# EAGLE board orb (EAGLE 9.6.2), part 1 of 2
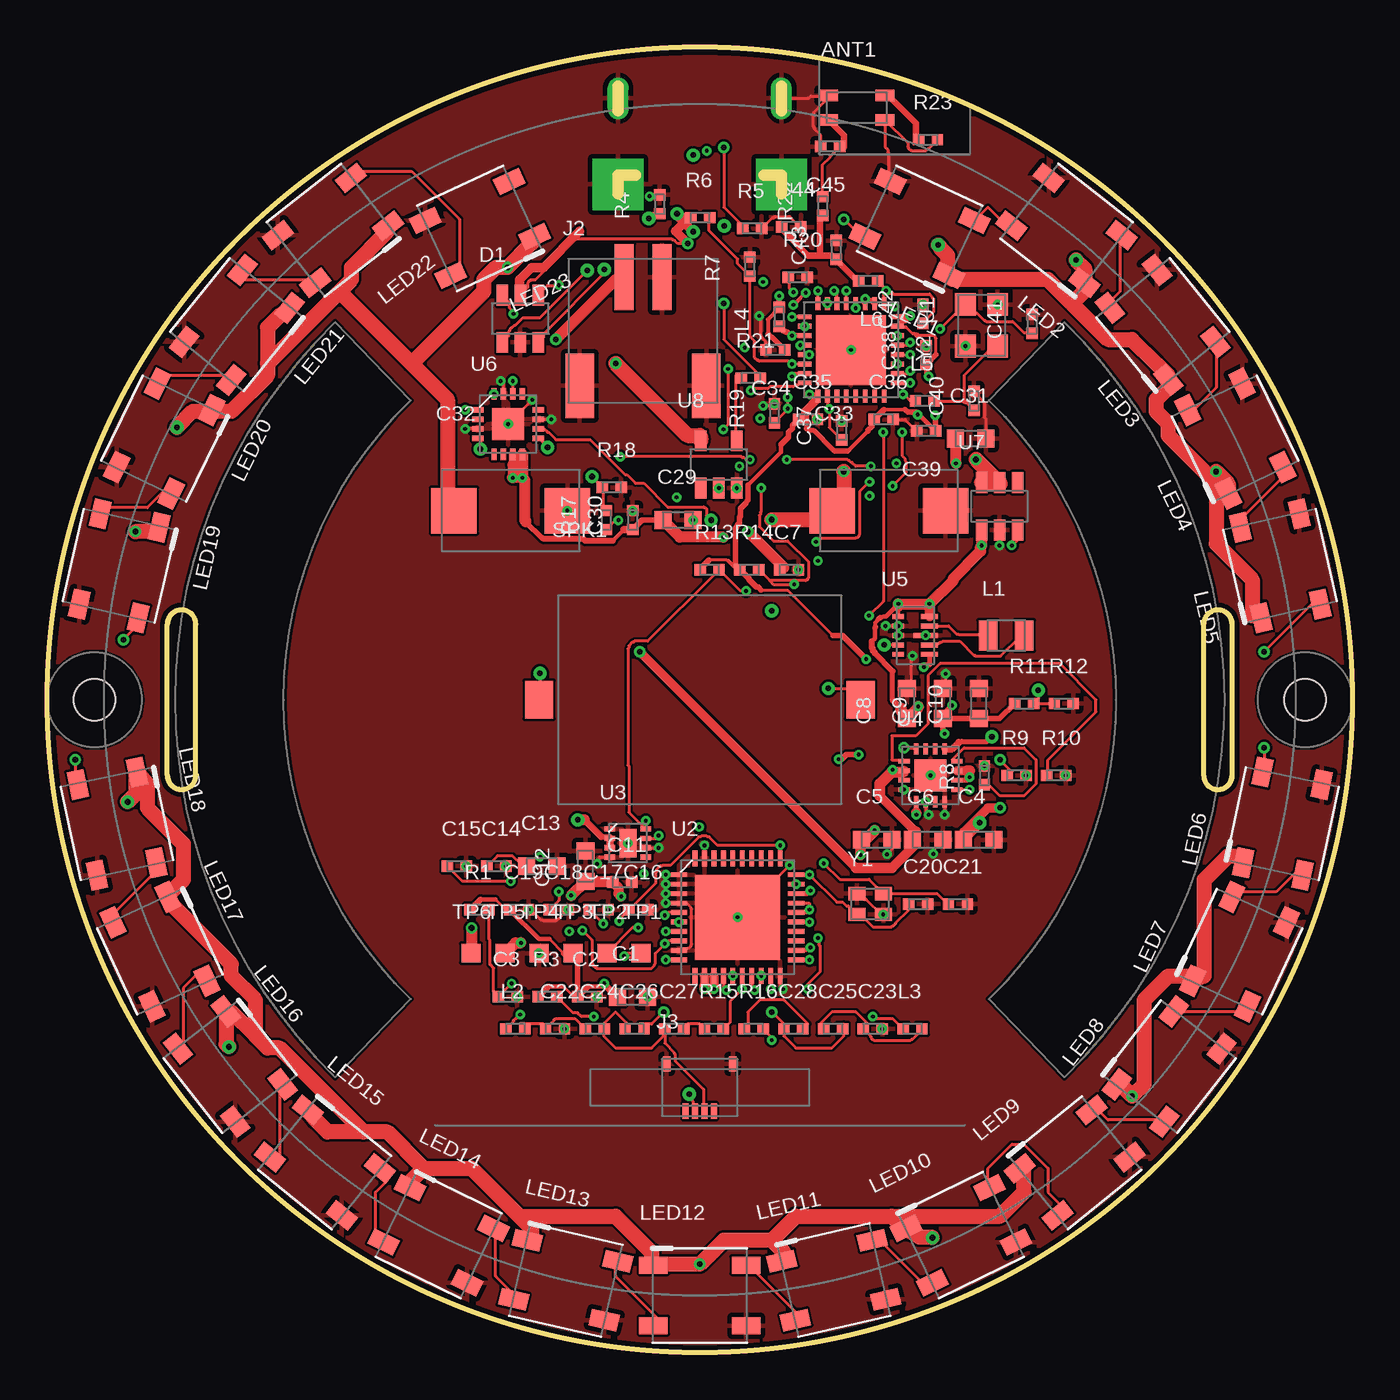
[diagram p6: board, top side]
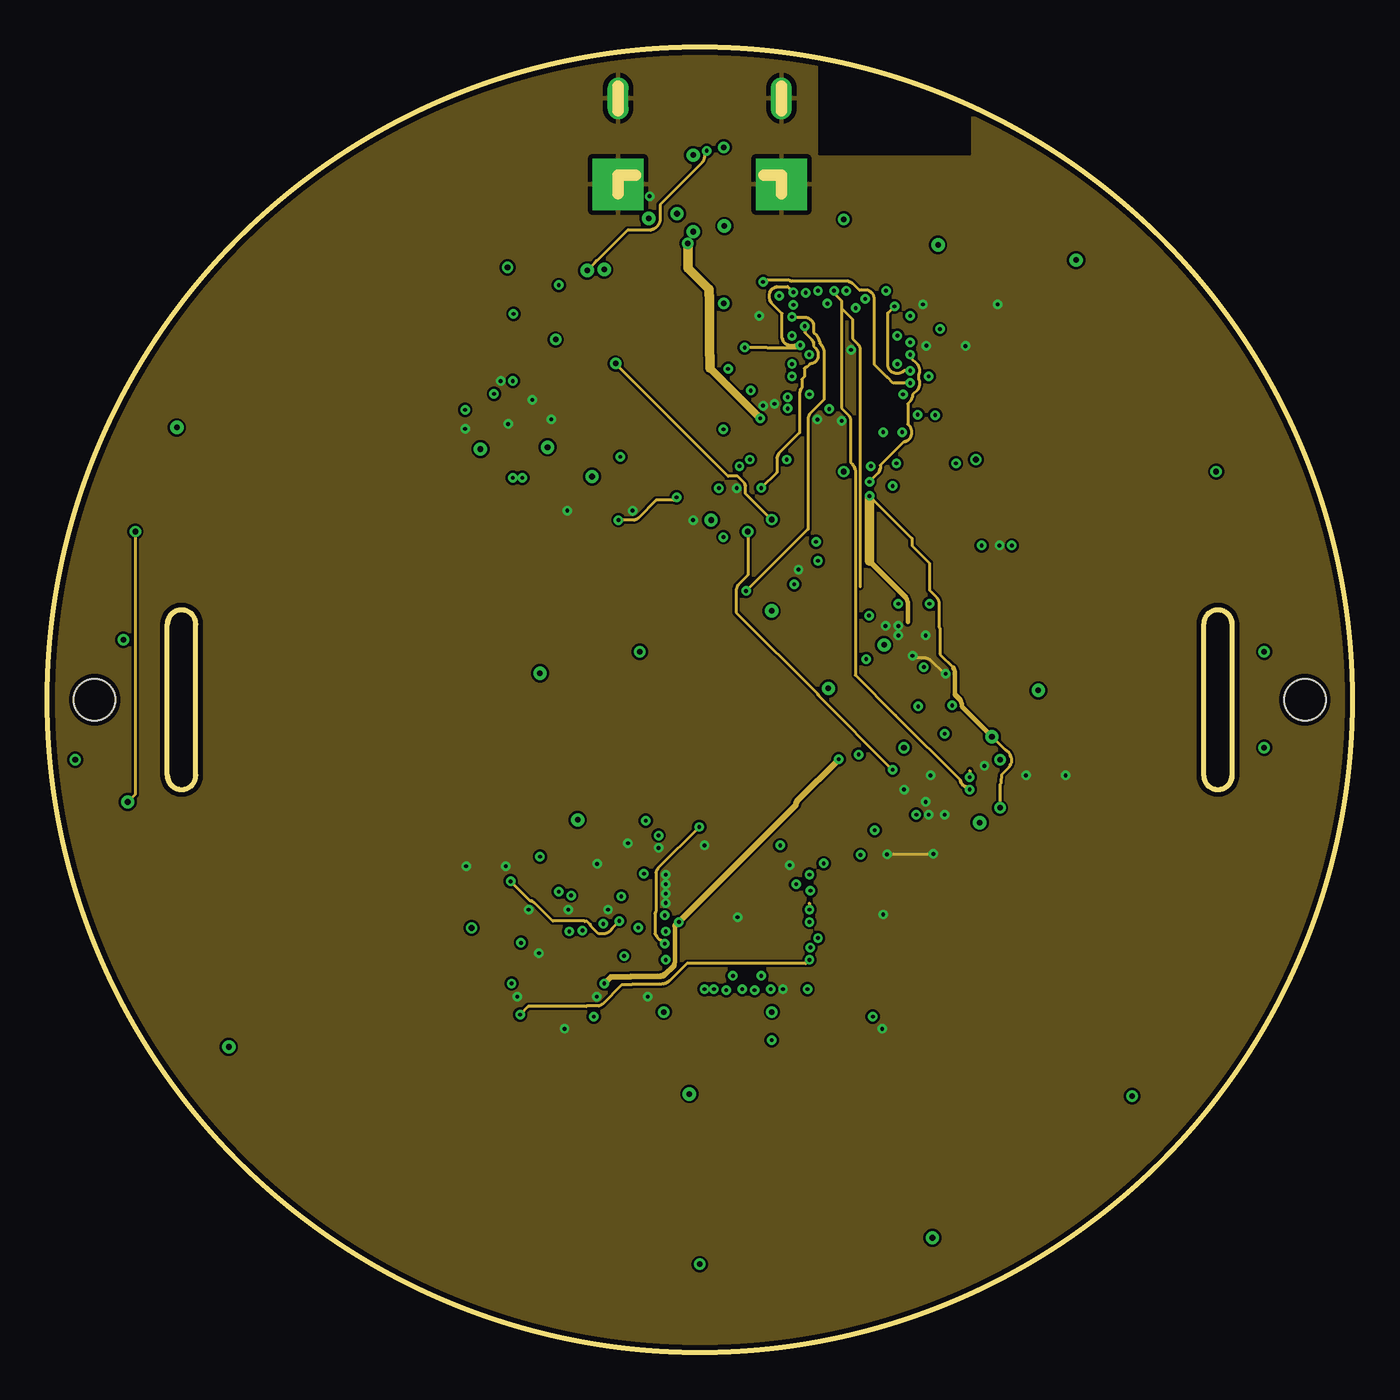
[diagram p7: board, inner layer Route2]
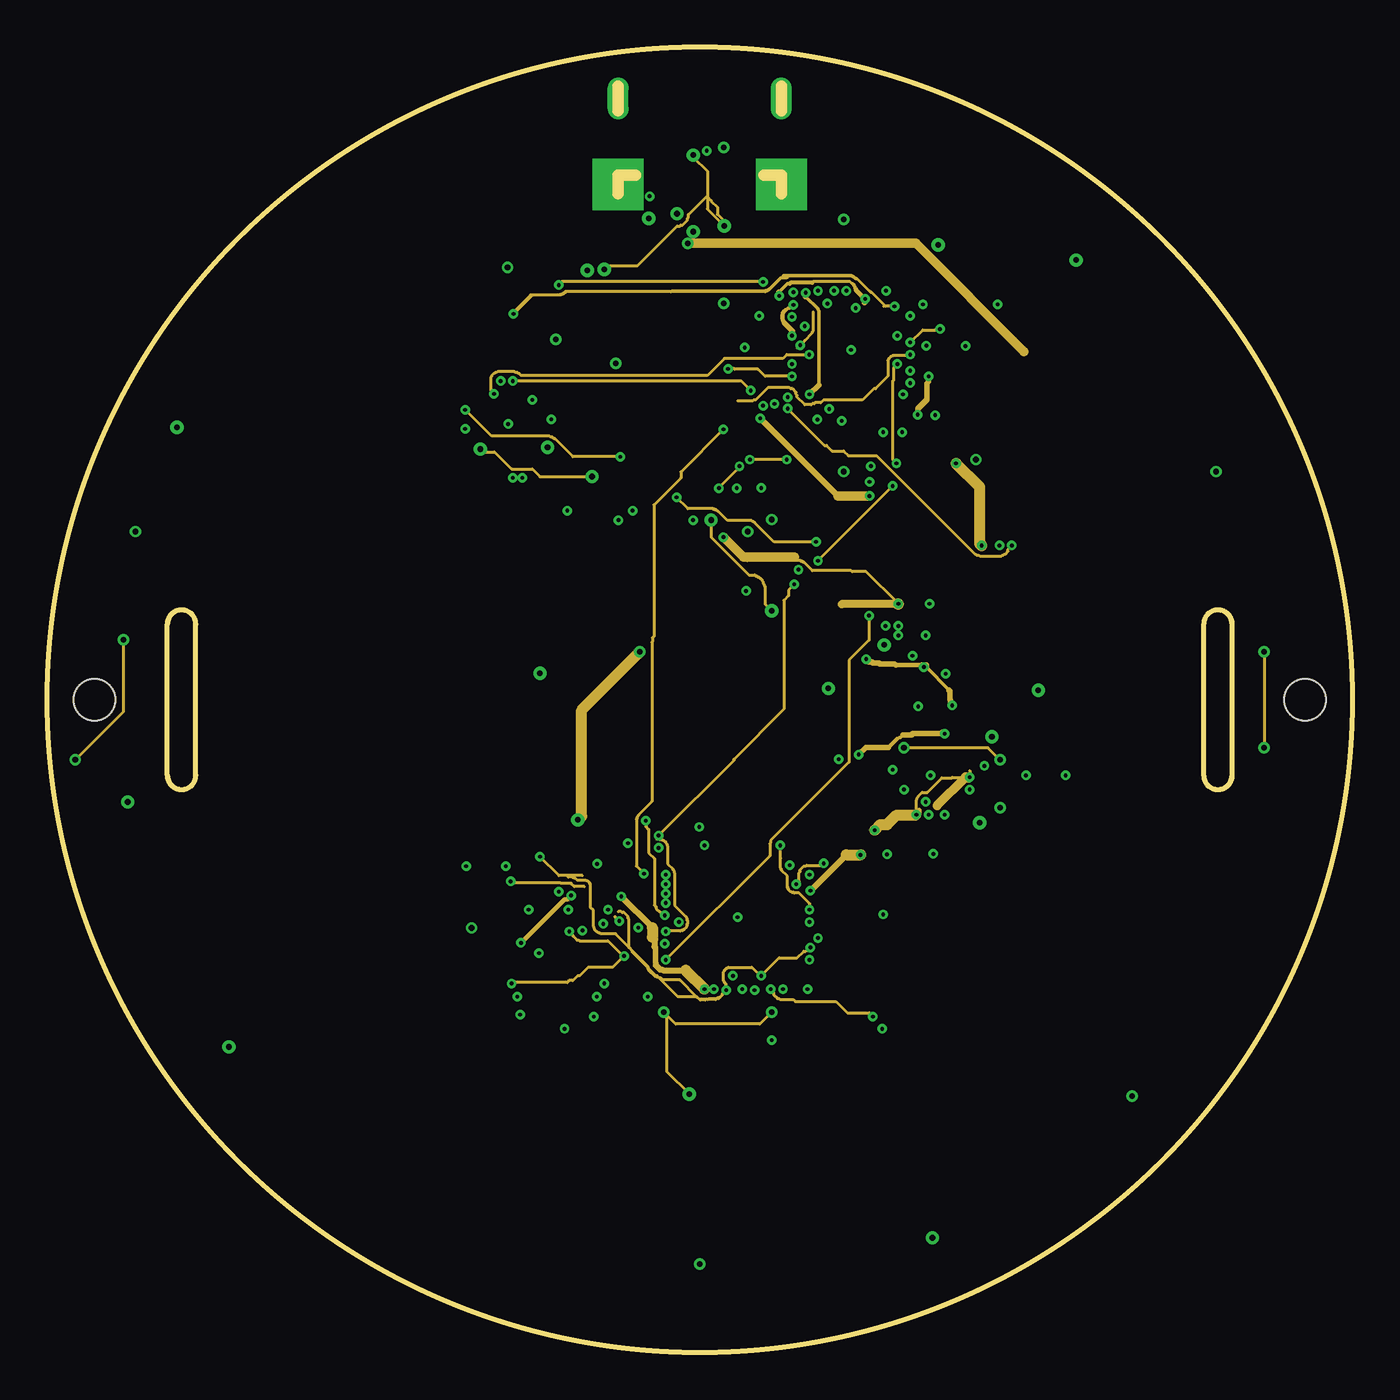
[diagram p8: board, inner layer Route15]
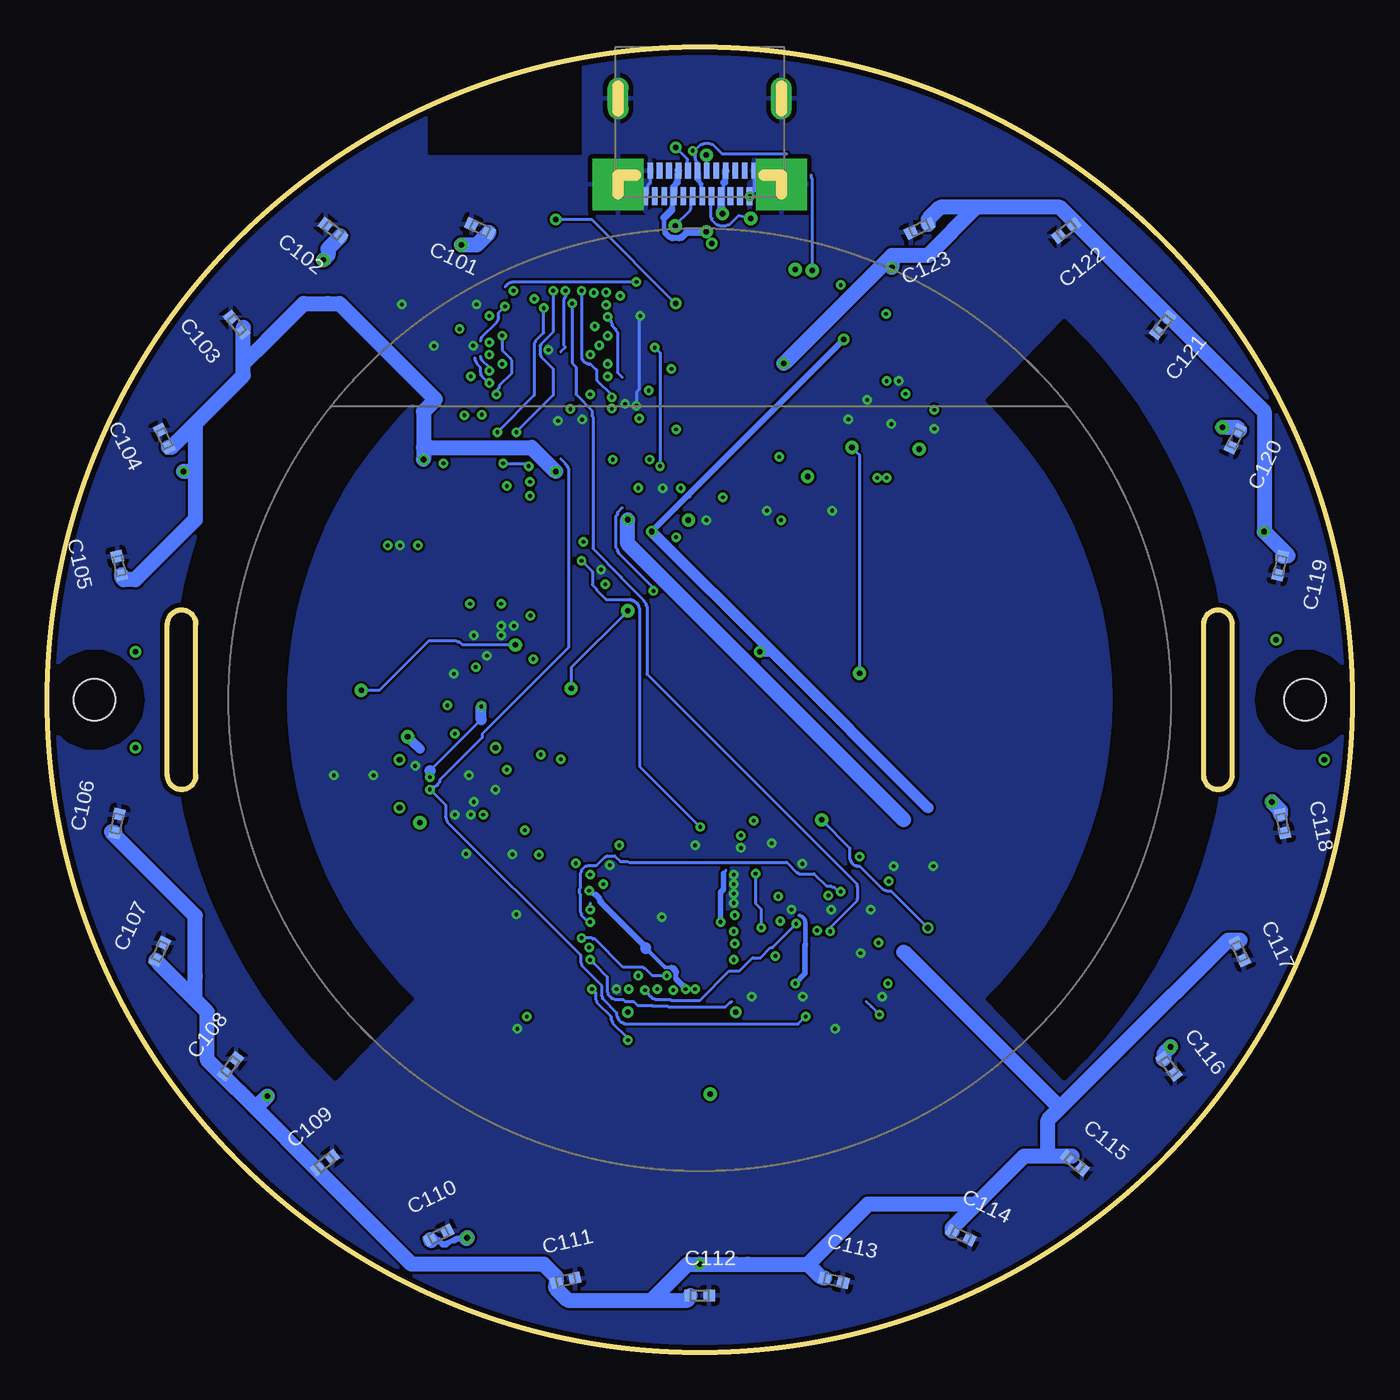
[diagram p9: board, bottom side, seen from below]

Size 69 x 69 mm. Coordinates in mm from the lower left corner, seen from the top.
Outline: 7.85,30.5 7.85,38.5 arc180 6.35,38.5 6.35,30.5 arc180 7.85,30.5
Outline: 62.65,30.5 62.65,38.5 arc180 61.15,38.5 61.15,30.5 arc180 62.65,30.5
Outline: circle at 34.5,34.5 radius 34.5
Copper layers (1+2*15+16): Top / Route2 / Route15 / Bottom
Stack-up Default Layer Stack: Top User Defined 0.035mm / Dielectric-2 User Defined 0.2104mm / Route2 User Defined 0.0152mm / Dielectric-1 User Defined 1.065mm / Route15 User Defined 0.0152mm / Dielectric-3 User Defined 0.2mm / Bottom User Defined 0.035mm
Design rules: minimum drill size class=1 0.2mm, minimum drill size class=2 0.2mm, minimum drill size class=5 0.2mm, minimum drill size class=3 0.2mm, minimum drill size class=4 0.2mm, minimum drill size class=0 0.2mm, minimum drill size 0.2mm, minimum copper width class=2 0.15mm, minimum copper width class=1 0.15mm, minimum copper width class=4 0.15mm, minimum copper width class=3 0.15mm, minimum copper width class=5 0.15mm, minimum copper width class=0 0.15mm, minimum copper width 0.15mm, keepout clearance 0mil, drill distance 0.2mm, via restrict clearance 0mil, dimension clearance 0.25mm, restrict clearance 0mil, copper clearance wire_polygon to wire_polygon 5mil, copper clearance wire_polygon to pad_smd 5mil, copper clearance wire_polygon to via 5mil, copper clearance pad_smd to pad_smd 5mil, copper clearance pad_smd to via 5mil, copper clearance via to via 5mil, copper clearance smd to pad (same net) 5mil, copper clearance smd to via (same net) 0mm, copper clearance smd to smd (same net) 5mil
Net classes: 0 signal: width 0.15 mm, drill 0.2 mm; 1 power: width 0.15 mm, drill 0.2 mm; 2 LED-power: width 0.15 mm, drill 0.2 mm; 3 3V3: width 0.15 mm, drill 0.2 mm; 4 RF: width 0.15 mm, drill 0.2 mm; 5 USB: width 0.15 mm, drill 0.2 mm
Holes 2.2 mm at 2.5,34.5 66.5,34.5
tRestrict: area 0,32 to 5,37; area 64,32 to 69,37; area 49.8,14.5 to 62.2,54.5; area 6.8,14.5 to 19.2,54.5
bRestrict: area 0,32 to 5,37; area 64,32 to 69,37; area 49.8,14.5 to 62.2,54.5; area 6.8,14.5 to 19.2,54.5
vRestrict: area 49.8,14.5 to 62.2,54.5; area 6.8,14.5 to 19.2,54.5

## Footprints (pad centres in the part's own frame; a part is rotated, then mirrored left to right if it is on the bottom)
JOHANSON_2450AT18D = smd 1 x 0.6: 1 -1.5,-0.65; 2 1.5,-0.65; 3 1.5,0.65; 4 -1.5,0.65
C0603 = smd 0.9 x 0.95: 1 -0.8,0; 2 0.8,0
C0402 = smd 0.6 x 0.6: 1 -0.5,0; 2 0.5,0
CPOL7343 = smd 2.4 x 2.4: 1 -3,0; 2 3,0
SOT23_6 = smd 0.6 x 1.1: 1 -0.95,-1.25; 2 0,-1.25; 3 0.95,-1.25; 4 0.95,1.25; 5 0,1.25; 6 -0.95,1.25
USBC24_TE2345986 = smd 0.3 x 0.95: A1 2.625,-7.875; A2 2.125,-7.875; A3 1.625,-7.875; A4 1.125,-7.875; A5 0.625,-7.875; A6 0.125,-7.875; A7 -0.375,-7.875; A8 -0.875,-7.875; A9 -1.375,-7.875; A10 -1.875,-7.875; A11 -2.375,-7.875; A12 -2.875,-7.875 | smd 0.3 x 0.85: B1 -2.625,-6.525; B2 -2.125,-6.525; B3 -1.625,-6.525; B4 -1.125,-6.525; B5 -0.625,-6.525; B6 -0.125,-6.525; B7 0.375,-6.525; B8 0.875,-6.525; B9 1.375,-6.525; B10 1.875,-6.525; B11 2.375,-6.525; B12 2.875,-6.525 | drill 0.6 pad 2.7 square: S1 -4.32,-7.25; S2 4.32,-7.25 | drill 0.6 pad 1.075 long: S3 -4.32,-2.7; S4 4.32,-2.7
JST_S2B_PH_SM4_TB = smd 1 x 3.5: 1 -1,2.85; 2 1,2.85 | smd 1.5 x 3.4: S1 -3.35,-2.9; S2 3.35,-2.9
FPC4_PLACEHOLDER = smd 0.3 x 0.8: 1 0.75,-1.25; 2 0.25,-1.25; 3 -0.25,-1.25; 4 -0.75,-1.25 | smd 0.4 x 0.8: M1 -1.75,1.25; M2 1.75,1.25
L2016 = smd 1 x 1.6: 1 -0.95,0; 2 0.95,0
L0402 = smd 0.6 x 0.6: 1 -0.5,0; 2 0.5,0
WS2812B_5050 = smd 1.5 x 0.9: 1 -2.45,1.6; 2 -2.45,-1.6; 3 2.45,-1.6; 4 2.45,1.6
R0402 = smd 0.6 x 0.6: 1 -0.5,0; 2 0.5,0
SPK_PADS = smd 1.5 x 2: 1 -8.5,0; 2 8.5,0
TP1MM = smd 1 x 1: 1 0,0
ESP32C3_QFN32 = smd 0.7 x 0.25: 1 -2.45,1.75; 2 -2.45,1.25; 3 -2.45,0.75; 4 -2.45,0.25; 5 -2.45,-0.25; 6 -2.45,-0.75; 7 -2.45,-1.25; 8 -2.45,-1.75; 17 2.45,-1.75; 18 2.45,-1.25; 19 2.45,-0.75; 20 2.45,-0.25; 21 2.45,0.25; 22 2.45,0.75; 23 2.45,1.25; 24 2.45,1.75 | smd 0.25 x 0.7: 9 -1.75,-2.45; 10 -1.25,-2.45; 11 -0.75,-2.45; 12 -0.25,-2.45; 13 0.25,-2.45; 14 0.75,-2.45; 15 1.25,-2.45; 16 1.75,-2.45; 25 1.75,2.45; 26 1.25,2.45; 27 0.75,2.45; 28 0.25,2.45; 29 -0.25,2.45; 30 -0.75,2.45; 31 -1.25,2.45; 32 -1.75,2.45 | smd 3.7 x 3.7: 33 0,0
HVQFN40_6X6 = smd 0.85 x 0.25: 1 -3.1,2.25; 2 -3.1,1.75; 3 -3.1,1.25; 4 -3.1,0.75; 5 -3.1,0.25; 6 -3.1,-0.25; 7 -3.1,-0.75; 8 -3.1,-1.25; 9 -3.1,-1.75; 10 -3.1,-2.25; 21 3.1,-2.25; 22 3.1,-1.75; 23 3.1,-1.25; 24 3.1,-0.75; 25 3.1,-0.25; 26 3.1,0.25; 27 3.1,0.75; 28 3.1,1.25; 29 3.1,1.75; 30 3.1,2.25 | smd 0.25 x 0.85: 11 -2.25,-3.1; 12 -1.75,-3.1; 13 -1.25,-3.1; 14 -0.75,-3.1; 15 -0.25,-3.1; 16 0.25,-3.1; 17 0.75,-3.1; 18 1.25,-3.1; 19 1.75,-3.1; 20 2.25,-3.1; 31 2.25,3.1; 32 1.75,3.1; 33 1.25,3.1; 34 0.75,3.1; 35 0.25,3.1; 36 -0.25,3.1; 37 -0.75,3.1; 38 -1.25,3.1; 39 -1.75,3.1; 40 -2.25,3.1 | smd 4.5 x 4.5: 41 0,0
TDFN8_2X2 = smd 0.55 x 0.28: 1 -0.95,0.75; 2 -0.95,0.25; 3 -0.95,-0.25; 4 -0.95,-0.75; 5 0.95,-0.75; 6 0.95,-0.25; 7 0.95,0.25; 8 0.95,0.75 | smd 0.9 x 1.5: 9 0,0
VQFN16_3X3 = smd 0.6 x 0.24: 1 -1.4,0.75; 2 -1.4,0.25; 3 -1.4,-0.25; 4 -1.4,-0.75; 9 1.4,-0.75; 10 1.4,-0.25; 11 1.4,0.25; 12 1.4,0.75 | smd 0.24 x 0.6: 5 -0.75,-1.4; 6 -0.25,-1.4; 7 0.25,-1.4; 8 0.75,-1.4; 13 0.75,1.4; 14 0.25,1.4; 15 -0.25,1.4; 16 -0.75,1.4 | smd 1.68 x 1.68: 17 0,0
VSON10_2X3 = smd 0.6 x 0.25: 1 -0.9,1; 2 -0.9,0.5; 3 -0.9,0; 4 -0.9,-0.5; 5 -0.9,-1 | smd 0.9 x 0.25: 6 0.75,-1; 7 0.75,-0.5; 9 0.75,0.5; 10 0.75,1 | smd 1.3 x 0.25: 8 0.55,0
TQFN16_3X3 = smd 0.6 x 0.28: 1 -1.6,0.75; 2 -1.6,0.25; 3 -1.6,-0.25; 4 -1.6,-0.75; 9 1.6,-0.75; 10 1.6,-0.25; 11 1.6,0.25; 12 1.6,0.75 | smd 0.28 x 0.6: 5 -0.75,-1.6; 6 -0.25,-1.6; 7 0.25,-1.6; 8 0.75,-1.6; 13 0.75,1.6; 14 0.25,1.6; 15 -0.25,1.6; 16 -0.75,1.6 | smd 1.7 x 1.7: 17 0,0
SOT23_5 = smd 0.6 x 1.1: 1 -0.95,-1.25; 2 0,-1.25; 3 0.95,-1.25; 4 0.95,1.25; 5 -0.95,1.25
XTAL2016 = smd 0.9 x 0.7: 1 -0.7,-0.55; 2 0.7,-0.55; 3 0.7,0.55; 4 -0.7,0.55
ABM8_3225 = smd 1.2 x 1.1: 1 -1.1,-0.85; 2 1.1,-0.85; 3 1.1,0.85; 4 -1.1,0.85

## Placement (x,y rotation side)
ANT1  2450AT18D0100001E  [JOHANSON_2450AT18D]  42.8,65.8 0 top
C1  10uF  [C0603]  30.95,18.8 0 top
C2  100nF  [C0402]  28.55,18.8 0 top
C3  1uF  [C0402]  24.35,18.8 0 top
C4  4.7uF  [C0603]  49.25,27.1 0 top
C5  10uF  [C0603]  43.85,27.1 0 top
C6  10uF  [C0603]  46.55,27.1 0 top
C7  100nF  [C0402]  39.22,41.38 0 top
C8  10uF  [C0603]  45.45,34.3 90 top
C9  10uF  [C0603]  47.35,34.3 90 top
C10  10uF  [C0603]  49.25,34.3 90 top
C11  100nF  [C0402]  30.4,24.85 0 top
C12  4.7uF  [C0603]  28.45,25.7 90 top
C13  4.7uF  [C0603]  26.15,25.7 0 top
C14  100nF  [C0402]  23.75,25.7 0 top
C15  1uF  [C0402]  21.65,25.7 0 top
C16  100nF  [C0402]  31.25,23.4 0 top
C17  100nF  [C0402]  29.15,23.4 0 top
C18  100nF  [C0402]  27.05,23.4 0 top
C19  100nF  [C0402]  24.95,23.4 0 top
C20  12pF  [C0402]  46.05,23.7 0 top
C21  12pF  [C0402]  48.15,23.7 0 top
C22  TBD  [C0402]  26.85,17.1 0 top
C23  TBD  [C0402]  43.65,17.1 0 top
C24  TBD  [C0402]  28.95,17.1 0 top
C25  TBD  [C0402]  41.55,17.1 0 top
C26  TBD  [C0402]  31.05,17.1 0 top
C27  TBD  [C0402]  33.15,17.1 0 top
C28  TBD  [C0402]  39.45,17.1 0 top
C29  10uF  [C0603]  33.35,44 0 top
C30  100nF  [C0402]  30.95,44 90 top
C31  10uF  [C0603]  48.82,48.3 0 top
C32  100uF  [CPOL7343]  24.5,44.5 0 top
C33  100uF  [CPOL7343]  44.5,44.5 0 top
C34  1uF  [C0402]  38.5,53 180 top
C35  100nF  [C0402]  40.22,49.32 0 top
C36  100nF  [C0402]  44.22,49.32 0 top
C37  1uF  [C0402]  42,48.75 90 top
C38  1uF  [C0402]  46.48,52.72 90 top
C39  10nF  [C0402]  46.47,48.71 180 top
C40  16pF  [C0402]  49,50.3 90 top
C41  16pF  [C0402]  52.07,54.37 90 top
C42  1pF  [C0402]  46.3,54.9 90 top
C43  1pF  [C0402]  41.72,58.28 90 top
C44  1pF  [C0402]  39.34,59.5 0 top
C45  1pF  [C0402]  41.4,63.75 180 top
C101  100nF  [C0402]  46.12,59.42 155 bottom
C102  100nF  [C0402]  53.89,59.32 142 bottom
C103  100nF  [C0402]  58.98,54.32 129 bottom
C104  100nF  [C0402]  62.81,48.31 116 bottom
C105  100nF  [C0402]  65.19,41.59 103 bottom
C106  100nF  [C0402]  65.31,27.95 78 bottom
C107  100nF  [C0402]  63.05,21.19 65 bottom
C108  100nF  [C0402]  59.32,15.11 52 bottom
C109  100nF  [C0402]  54.32,10.02 39 bottom
C110  100nF  [C0402]  48.31,6.19 26 bottom
C111  100nF  [C0402]  41.59,3.81 13 bottom
C112  100nF  [C0402]  34.5,3 0 bottom
C113  100nF  [C0402]  27.41,3.81 347 bottom
C114  100nF  [C0402]  20.69,6.19 334 bottom
C115  100nF  [C0402]  14.68,10.02 321 bottom
C116  100nF  [C0402]  9.68,15.11 308 bottom
C117  100nF  [C0402]  5.95,21.19 295 bottom
C118  100nF  [C0402]  3.69,27.95 282 bottom
C119  100nF  [C0402]  3.81,41.59 257 bottom
C120  100nF  [C0402]  6.19,48.31 244 bottom
C121  100nF  [C0402]  10.02,54.32 231 bottom
C122  100nF  [C0402]  15.11,59.32 218 bottom
C123  100nF  [C0402]  22.88,59.42 205 bottom
D1  USBLC6-2SC6  [SOT23_6]  25.01,54.65 0 top
J1  USB-C  [USBC24_TE2345986]  34.5,69 0 bottom
J2  BAT  [JST_S2B_PH_SM4_TB]  31.5,54 0 top
J3  NFC antenna  [FPC4_PLACEHOLDER]  34.5,14 0 top
L1  0.47uH  [L2016]  50.7,37.9 0 top
L2  TBD  [L0402]  24.75,17.1 0 top
L3  TBD  [L0402]  45.75,17.1 0 top
L4  2nH  [L0402]  38.7,54.75 90 top
L5  24nH  [L0402]  46.4,50.3 0 top
L6  2.4nH  [L0402]  43.4,56.65 180 top
LED1  WS2812B  [WS2812B_5050]  46.12,59.42 155 top
LED2  WS2812B  [WS2812B_5050]  53.89,59.32 142 top
LED3  WS2812B  [WS2812B_5050]  58.98,54.32 129 top
LED4  WS2812B  [WS2812B_5050]  62.81,48.31 116 top
LED5  WS2812B  [WS2812B_5050]  65.19,41.59 103 top
LED6  WS2812B  [WS2812B_5050]  65.31,27.95 78 top
LED7  WS2812B  [WS2812B_5050]  63.05,21.19 65 top
LED8  WS2812B  [WS2812B_5050]  59.32,15.11 52 top
LED9  WS2812B  [WS2812B_5050]  54.32,10.02 39 top
LED10  WS2812B  [WS2812B_5050]  48.31,6.19 26 top
LED11  WS2812B  [WS2812B_5050]  41.59,3.81 13 top
LED12  WS2812B  [WS2812B_5050]  34.5,3 0 top
LED13  WS2812B  [WS2812B_5050]  27.41,3.81 347 top
LED14  WS2812B  [WS2812B_5050]  20.69,6.19 334 top
LED15  WS2812B  [WS2812B_5050]  14.68,10.02 321 top
LED16  WS2812B  [WS2812B_5050]  9.68,15.11 308 top
LED17  WS2812B  [WS2812B_5050]  5.95,21.19 295 top
LED18  WS2812B  [WS2812B_5050]  3.69,27.95 282 top
LED19  WS2812B  [WS2812B_5050]  3.81,41.59 257 top
LED20  WS2812B  [WS2812B_5050]  6.19,48.31 244 top
LED21  WS2812B  [WS2812B_5050]  10.02,54.32 231 top
LED22  WS2812B  [WS2812B_5050]  15.11,59.32 218 top
LED23  WS2812B  [WS2812B_5050]  22.88,59.42 205 top
R1  10k  [R0402]  22.85,23.4 0 top
R3  100k  [R0402]  26.45,18.8 0 top
R4  5.1k  [R0402]  32.38,60.7 90 top
R5  5.1k  [R0402]  37.27,59.42 0 top
R6  120k  [R0402]  34.52,59.99 0 top
R7  220k  [R0402]  37.15,57.4 90 top
R8  1.8k  [R0402]  49.55,30.5 90 top
R9  1.13k  [R0402]  51.25,30.5 0 top
R10  10k  [R0402]  53.35,30.5 0 top
R11  560k  [R0402]  51.65,34.3 0 top
R12  100k  [R0402]  53.75,34.3 0 top
R13  2.2k  [R0402]  35.02,41.38 0 top
R14  2.2k  [R0402]  37.12,41.38 0 top
R15  TBD  [R0402]  35.25,17.1 0 top
R16  TBD  [R0402]  37.35,17.1 0 top
R17  2k  [R0402]  29.55,44 90 top
R18  100k  [R0402]  29.85,45.73 0 top
R19  100k  [R0402]  38.45,49.65 90 top
R20  100k  [R0402]  39.68,56.84 0 top
R21  33  [R0402]  37.2,51.51 0 top
R22  0  [R0402]  41,60.6 90 top
R23  0  [R0402]  46.57,64.11 0 top
SPK1  CMS-151103-088SP  [SPK_PADS]  34.5,34.5 0 top
TP1  EN  [TP1MM]  31.4,21.1 0 top
TP2  BOOT  [TP1MM]  29.6,21.1 0 top
TP3  3V3  [TP1MM]  27.8,21.1 0 top
TP4  GND  [TP1MM]  26,21.1 0 top
TP5  VSYS  [TP1MM]  24.2,21.1 0 top
TP6  VBAT  [TP1MM]  22.4,21.1 0 top
U1  ESP32-C3FH4X  [ESP32C3_QFN32]  42.5,53 270 top
U2  PN7161A1HN/C101E  [HVQFN40_6X6]  36.5,23 0 top
U3  MAX17048G+T10  [TDFN8_2X2]  30.7,26.92 0 top
U4  BQ24074RGTR  [VQFN16_3X3]  46.7,30.5 0 top
U5  TPS63802DLAR  [VSON10_2X3]  45.9,37.9 0 top
U6  MAX98357AETE+T  [TQFN16_3X3]  24.37,49.08 0 top
U7  TPS22918DBVR  [SOT23_6]  50.35,44.73 0 top
U8  SN74LV1T34DBVR  [SOT23_5]  35.51,46.94 0 top
Y1  27.12MHz  [XTAL2016]  43.5,23.7 0 top
Y2  40MHz  [ABM8_3225]  49.4,54.3 90 top

## Tracks (layer width: path | path; a pad name or v marks a point on that pad's centre or on a via)
3V3  (via drill 0.2 pad 0.45, 0.2 pad 0.5)
  Top 0.15: 24.25,23.4 23.7,23.95 | 29.95,18.8 29.4,19.35 v29.45,19.5 29.48,19.48 | 36,41.85 35.95,41.85 35.9,41.9 | 27.85,18.8 27.35,19.3 27.3,19.3 27.25,19.35 | 47,53.6 46.95,53.65 46.95,53.7 46.9,53.75 46,53.75 | 27.3,21.1 26.55,21.85 | 37.75,40.3 39.15,40.3 41.55,37.9 | 39.5,53.75 v39.38,53.75 | 45.5,54.75 v45.62,54.8 45.6,54.8 | 39.35,53.75 v39.38,53.75 | 45.95,49.7 v46.02,49.58 46.02,49.62 | 40.35,50.6 v40.3,50.65 | 46.5,51.7 v46.6,51.6 | 47.35,32.8 v47.45,32.7 | 42,31.35 v41.85,31.35 | 46.48,36.35 v46.35,36.23 | 39.4,53.85 v39.38,53.75 | 39.48,55.38 v39.45,55.38
  Top 0.16: 45.85,53.85 45.75,53.85 45.4,54.2
  Top 0.166: 35.9,41.9 35,41.9 | 47,52.75 47,53.6
  Top 0.182: 45.4,54.2 45,54.2 U1.31
  Top 0.186: 44.25,49.85 45.35,49.85
  Top 0.187: 39.83,55.73 39.83,55.75 v40.1,56.02
  Top 0.198: 45.95,53.8 45.9,53.8 45.85,53.85
  Top 0.216: 38.8,47.6 37.05,45.85 | 39.48,55.38 39.83,55.73
  Top 0.221: 36.45,41.4 36,41.85 | 42.4,47.7 43.4,48.7
  Top 0.226: 23.7,23.95 22.9,23.95 | 29.4,19.35 28.6,19.35 | 27.25,19.35 26.5,19.35 | 26.55,21.85 26,21.85 C19.1 | 38.8,48 38.8,47.6
  Top 0.236: 42.3,47.65 42.35,47.7 42.4,47.7
  Top 0.237: 40.2,49.8 40.2,49.75 40.15,49.7
  Top 0.249: 45.95,49.7 46.02,49.62 46.95,48.7
  Top 0.251: 46,53.75 45.95,53.8
  Top 0.263: 37.05,45.05 36.95,44.95 36.95,44.9
  Top 0.265: 41.55,47.7 41.6,47.7 41.65,47.65
  Top 0.266: 40.15,49.7 40.15,48.85 | 40.25,48.75 40.5,48.75 41.55,47.7
  Top 0.271: 36.5,43.75 36.5,43.7 36.45,43.65
  Top 0.276: U5.6 46.65,36.35 | 46.65,36.35 v46.35,36.23 | U1.31 45.25,54.55 | 46.65,36.35 46.48,36.35 | U1.11 39.5,53.75 U1.11
  Top 0.278: 46.5,52.25 47,52.75
  Top 0.28: 36.45,43.65 36.45,43.6 36.4,43.55
  Top 0.287: 37.1,40.85 37.5,40.45
  Top 0.29: U1.32 45.5,54.75 v45.62,54.8 45.6,54.8 45.35,54.55 45.25,54.55 | L4.1 38.95,54 39,54 39.05,53.95 39.15,53.95 39.35,53.75 v39.38,53.75 39.5,53.75 39.4,53.85 | U1.17 40,49.8 40,49.6 C35.1 | 39.7,49.3 C35.1 | C9.1 C10.1 50.35,33.5 R11.1 | C19.1 24.25,23.4 | 22.9,23.95 R1.1 | C1.1 29.95,18.8 | 28.6,19.35 C2.1 | R14.1 36.6,41.4 | 36.6,41.4 36.45,41.4 | 35,41.9 34.5,41.4 R13.1 | C2.1 27.85,18.8 | 26.5,19.35 R3.1 | C2.1 28.05,20.85 TP3.1 27.3,21.1 | 46.5,52.2 C38.1 46.5,52.2 | 46.5,52.2 46.5,52.25 | v47.85,34.2 47.6,33.95 47.6,33.9 47.4,33.7 47.4,33.55 C9.1 | U1.17 40.75,50.35 40.2,49.8 | 40.15,48.85 40.25,48.75 | 41.65,47.65 42.3,47.65 | 43.4,48.7 43.4,48.75 43.6,48.95 43.6,49.2 43.7,49.3 | 43.7,49.3 C36.1 | C36.1 43.7,49.3 | 45.35,49.85 45.5,49.7 45.95,49.7 46.02,49.62 v46.02,49.58 | 46.95,48.7 C39.1 46.95,48.7 | v40.3,50.65 40.35,50.6 40.7,50.6 U1.17 | 46.95,48.7 v46.95,49.55 | v46.6,51.6 46.5,51.7 46.5,52.2 | C35.1 39.7,49.3 | 39.7,49.3 39.4,49 39.4,48.85 39.2,48.65 39.2,48.4 38.8,48 | 37.05,45.85 37.05,45.05 | 36.95,44.9 36.65,44.6 36.65,44.2 36.6,44.15 36.6,43.85 36.5,43.75 | 36.4,43.55 36.4,41.6 36.6,41.4 | 36.6,41.4 R14.1 | R14.1 36.6,41.4 | 37.1,40.85 37.1,40.9 R14.1 | 37.5,40.45 37.6,40.45 37.75,40.3 | 41.55,37.9 42.05,37.9 v43.3,36.65 | C9.1 47.35,32.8 | 47.35,32.8 v47.45,32.7 47.35,32.8 | v42.9,31.6 42.25,31.6 42,31.35 v41.85,31.35 | v39.45,55.38 39.48,55.38 | 29.48,19.48 C1.1 | C35.1 39.7,49.3 | 43.7,49.3 C36.1 | C36.1 44.25,49.85 | 36.6,41.4 R14.1 | v29.45,19.5 29.48,19.48 | 29.48,19.48 C1.1
  Route2 0.223: 33.2,20.62 33.17,20.6 33.17,20.55
  Route2 0.226: 33.2,22.55 33.2,20.62
  Route2 0.233: 33.17,20.55 33.15,20.52 33.15,20.48
  Route2 0.257: 33.15,20.48 33.1,20.43 33.1,20.4
  Route2 0.287: 33.1,20.4 32.67,19.98
  Route2 0.29: v41.85,31.35 39.65,29.15 39.65,29.1 39.6,29.05 39.6,28.95 U2.6 33.2,22.55 | 32.67,19.98 32.62,19.98 32.55,19.9 32.45,19.9 32.42,19.88 30.88,19.88 30.85,19.85 29.8,19.85 v29.45,19.5
  Route15 0.15: 40.77,55.12 40.77,55.08 40.8,55.05 | 46.48,36.35 v46.35,36.23 | 46.48,36.23 v46.35,36.23 | 47.75,34.3 v47.85,34.2 | 43.45,36.5 v43.3,36.65 | 46.25,36.33 v46.35,36.23 | 39.4,53.85 v39.38,53.75 | 39.27,55.23 v39.45,55.38 39.3,55.23 | 40.1,55.83 v40.1,56.02 | 47.35,32.8 v47.45,32.7 | 47.3,32.75 v47.45,32.7 | 47.27,32.75 v47.45,32.7 | 47.25,32.73 v47.45,32.7
  Route15 0.159: 40.75,55.17 40.75,55.15 40.77,55.12
  Route15 0.16: 39.17,55.2 39.25,55.2 39.27,55.23
  Route15 0.17: 45.05,32.5 45,32.45 44.95,32.45
  Route15 0.175: 45.25,32.65 45.1,32.5 45.05,32.5
  Route15 0.176: 40.8,55.05 40.8,51.15
  Route15 0.177: 40.1,55.83 40.75,55.17
  Route15 0.181: 46.48,36.23 47.67,35.02
  Route15 0.187: 39.05,55.12 39.08,55.12 39.12,55.17
  Route15 0.188: 39.12,55.17 39.15,55.17 39.17,55.2 | 39.27,55.23 39.3,55.23 v39.45,55.38
  Route15 0.198: 38.88,54.83 38.9,54.85 38.9,54.95
  Route15 0.207: 44.95,32.45 44.48,31.98
  Route15 0.208: 38.9,54.55 38.9,54.62 38.88,54.65
  Route15 0.212: 38.9,54.95 38.95,55 38.95,55.02
  Route15 0.216: 38.95,55.02 39.05,55.12
  Route15 0.226: 44.88,36.33 46.25,36.33 | 38.98,54.42 38.98,54.45 38.92,54.5 | 38.88,54.65 38.88,54.83
  Route15 0.233: 38.92,54.5 38.92,54.52 38.9,54.55
  Route15 0.251: 39.4,54 38.98,54.42
  Route15 0.29: v46.6,51.6 46.6,51.33 46.5,51.23 46.5,50.38 46.02,49.9 46.02,49.62 v46.02,49.58 | 46.48,36.35 46.48,36.23 | 47.67,35.02 47.67,35 47.73,34.95 47.73,34.52 47.75,34.5 47.75,34.3 v47.85,34.2 | v43.3,36.65 43.45,36.5 43.6,36.5 43.65,36.45 43.98,36.45 44.02,36.4 44.8,36.4 44.88,36.33 | 46.25,36.33 v46.35,36.23 | 39.4,53.85 39.4,54 | v40.1,56.02 40.1,55.83 | 40.8,51.15 v40.3,50.65 | 47.35,32.8 47.3,32.75 47.27,32.75 47.25,32.73 45.77,32.73 45.7,32.65 45.25,32.65 | 44.48,31.98 43.27,31.98 v42.9,31.6
  Bottom 0.15: 29.48,19.48 v29.45,19.5
  Bottom 0.16: 29.27,23.1 29.2,23.1
  Bottom 0.166: 33.25,25.32 33.12,25.45 33.12,25.5
  Bottom 0.187: 29.15,23.07 29.1,23.02 29.07,23.02
  Bottom 0.188: 29.2,23.1 29.18,23.07 29.15,23.07
  Bottom 0.198: 29,22.95 29,22.93 28.95,22.88 | 28.93,22.82 28.93,22.75 28.9,22.73
  Bottom 0.211: 28.95,22.88 28.95,22.85 28.93,22.82
  Bottom 0.216: 29.07,23.02 29,22.95
  Bottom 0.226: 28.9,22.73 28.9,21.57
  Bottom 0.29: U2.6 33.4,24.32 33.25,24.48 33.25,25.32 | 28.9,21.57 28.93,21.55 28.93,20.02 v29.45,19.5 29.48,19.48
  other vias: 33.4,22.75
AMP_SD  (via drill 0.2 pad 0.5)
  Top 0.15: U1.28 45.5,52.75 | 30.05,44 v30.2,44 30.05,44 | 30.05,44 R17.1 | v43.48,46.02 42.95,45.5 42.95,43.25 42.92,43.23 42.92,43.17 42.9,43.15 42.9,43.12 42.88,43.1 42.85,43.1 42.8,43.05 42.75,43.05 42.73,43.02 40.83,43.02 v40.65,42.85 | 45.5,52.75 45.6,52.75 | 45.6,52.75 v45.62,52.75 | 45.5,52.75 45.6,52.75 | 45.6,52.75 v45.62,52.75 | 45.5,52.75 v45.62,52.75
  Route2 0.15: v45.62,52.75 45.62,52.62 46.02,52.23 46.02,52.2 46.08,52.15 46.08,52.1 46.1,52.08 46.1,52.02 46.12,52 46.12,51.77 46.1,51.77 46.1,51.7 46.08,51.7 46.08,51.45 46.1,51.42 46.1,51.38 46.12,51.35 46.12,51.12 46.1,51.1 46.1,51.05 46.08,51.02 46.08,50.98 46.02,50.92 46.02,50.9 45.75,50.62 45.75,50.52 45.73,50.5 45.73,50.45 45.7,50.42 45.7,50.38 45.65,50.33 45.65,50.3 45.5,50.15 45.5,49.08 45.6,48.98 45.6,48.95 45.65,48.9 45.65,48.85 45.67,48.83 45.67,48.77 45.7,48.75 45.7,48.52 45.67,48.5 45.67,48.45 45.65,48.42 45.65,48.38 45.6,48.33 45.6,48.3 45.52,48.23 45.5,48.23 45.45,48.17 45.4,48.17 45.38,48.15 45.33,48.15 45.3,48.12 45.27,48.12 44.05,46.9 44.05,46.73 44.02,46.7 44.02,46.65 44,46.62 44,46.58 43.95,46.52 43.95,46.5 v43.48,46.02 | v33.27,45.2 33.12,45.05 32.2,45.05 31.25,44.1 31.23,44.1 31.18,44.05 31.15,44.05 31.12,44.02 31.07,44.02 31.05,44 v30.2,44
  Route15 0.15: v45.62,52.75 45.6,52.75 | 36.5,50.3 37.3,50.3 37.35,50.35 37.45,50.35 38.1,51 39.25,51 39.3,50.95 39.4,50.95 39.6,50.75 39.6,50.65 39.65,50.6 39.65,50.5 40.05,50.1 40.4,50.1 40.45,50.15 40.55,50.15 40.6,50.2 40.9,50.2 41.05,50.35 43.1,50.35 43.7,50.95 43.8,50.95 44.45,51.6 44.45,52.45 44.5,52.5 44.5,52.55 44.6,52.65 44.65,52.65 44.7,52.7 45.55,52.7 | 45.6,52.75 45.55,52.7 | 45.6,52.75 v45.62,52.75 | 45.55,52.7 v45.62,52.75 | v40.65,42.85 38.42,42.85 37.4,43.88 37.38,43.88 37.33,43.92 37.27,43.92 37.23,43.98 35.98,43.98 35.48,44.48 35.45,44.48 35.4,44.52 35.38,44.52 35.35,44.55 35.3,44.55 35.27,44.58 35.23,44.58 35.2,44.6 33.88,44.6 v33.27,45.2
AMP_SD_R  (via drill 0.3 pad 0.7)
  Top 0.15: R17.2 29.42,44.66 29.42,45.93 R18.1 29.35,45.75 v28.8,46.3 | U6.4 22.75,48.35 U6.4 | v22.9,47.75 22.9,48.2 U6.4
  Route15 0.15: 23.05,47.6 v22.9,47.75 23.05,47.6 | 23.05,47.6 23.65,47.6 24.55,46.7 25.65,46.7 26.05,46.3 v28.8,46.3
ANT_FEED
  Top 0.15: R22.2 41,62.8 41.4,63.2 41.4,63.25 C45.1
  Top 0.35: C45.1 42.12,63.71 42.12,64.34 41.48,64.98 ANT1.1
ANT_GND_TUNE
  Top 0.35: R23.1 45.93,64.34 45.93,64.98 44.66,66.25 ANT1.3
BOOT  (via drill 0.2 pad 0.5)
  Top 0.15: U1.15 39.5,51.75 | 39.5,51.75 v39.38,51.6 39.5,51.75 | v36,52 36,49.05 v35.75,48.8 | v31.25,22.45 30.95,22.45 TP2.1
  Route15 0.15: v39.38,51.6 37.95,51.6 37.58,51.98 36.35,51.98 36.33,52 v36,52 | v35.75,48.8 33.5,46.55 33.5,46.23 32.08,44.8 32.08,37.85 32,37.77 32,37.58 31.98,37.55 31.98,29.12 31.25,28.4 31.25,28.38 31.2,28.32 31.2,28.3 31.18,28.27 31.18,28.2 31.15,28.18 31.15,25.7 v31.55,25.3
  Bottom 0.15: v31.55,25.3 31.55,23.73 31.27,23.45 31.27,22.48 | 31.27,22.48 v31.25,22.45 31.27,22.48
CC1  (via drill 0.3 pad 0.7)
  Top 0.15: R4.1 32.4,60.2 R4.1 | 31.75,60.2 v31.8,59.95 31.75,60.2 | R4.1 31.75,60.2
  Bottom 0.15: v31.8,59.95 32.45,60.1 32.95,59.6 33.05,59.6 33.1,59.55 33.45,59.55 33.5,59.6 33.6,59.6 33.85,59.85 33.85,59.95 33.9,60 33.9,61.05 33.85,61.1 J1.A5
CC2  (via drill 0.3)
  Top 0.15: v35.77,63.71 35.77,60.53 37.04,59.27 R5.1
  Bottom 0.15: v35.77,63.71 35.13,63.08 35.13,62.44 J1.B5
CHG_STATUS  (via drill 0.2 pad 0.5)
  Top 0.15: U1.6 41.75,56 | 41.75,56 v41.6,56.12 41.75,56 | U4.9 48.65,29.75 | v28.9,17.75 28.25,17.75 28.05,17.95 27.8,17.95 R3.2 | 48.65,29.75 48.75,29.75 | 48.75,29.75 v48.77,29.75 | 48.65,29.75 48.75,29.75 | 48.75,29.75 v48.77,29.75 | 48.65,29.75 v48.77,29.75
  Route2 0.15: v41.6,56.12 41.6,56 | 41.6,56 42,55.6 | 42,55.6 42,55.2 | 42,55.2 42.58,54.62 42.58,53.6 42.88,53.3 42.88,53.27 42.92,53.23 42.92,53.2 42.95,53.17 42.95,53.12 42.98,53.1 42.98,40.48 | 44.85,33.67 48.27,30.25 | 48.27,30.25 48.27,30.2 | 48.27,30.2 48.3,30.18 | 48.3,30.18 48.3,30.12 | 48.3,30.12 48.35,30.07 | 48.35,30.07 48.35,30.05 | 48.35,30.05 48.42,29.98 | 48.42,29.98 48.45,29.98 | 48.45,29.98 48.5,29.93 | 48.5,29.93 48.55,29.93 | 48.55,29.93 48.58,29.9 | 48.62,29.9 v48.77,29.75 | 41.6,56 v41.6,56.12 | 48.62,29.9 v48.77,29.75 | v41.6,56.12 41.6,56 | 41.6,56 42,55.6 | 48.27,30.25 48.27,30.2 | 48.27,30.2 48.3,30.18 | 48.3,30.18 48.3,30.12 | 48.3,30.12 48.35,30.07 | 48.35,30.07 48.35,30.05 | 48.35,30.05 48.42,29.98 | 48.42,29.98 48.45,29.98 | 48.45,29.98 48.5,29.93 | 48.5,29.93 48.55,29.93 | 48.55,29.93 48.58,29.9 | 48.62,29.9 v48.77,29.75 | 48.58,29.9 48.6,29.9 | 48.6,29.9 48.62,29.9 | 42,55.6 42,55.2 | 42,55.2 42,49.92 42.38,49.55 42.38,49.52 42.42,49.48 42.42,49.45 42.45,49.42 42.45,49.38 42.48,49.35 42.48,47.05 42.6,46.92 42.6,46.9 42.67,46.83 42.67,46.77 42.7,46.75 42.7,46.67 42.73,46.65 42.73,35.8 44.85,33.67 | 44.85,33.67 48.27,30.25 | 48.58,29.9 48.6,29.9 | 48.6,29.9 48.62,29.9 | 48.6,29.9 v48.77,29.75
  Bottom 0.15: v48.77,29.75 48.75,29.75 | 48.75,29.75 47.95,28.95 47.95,28.3 47.9,28.25 47.9,28.15 47.85,28.1 47.85,28.05 40.8,21 40.8,20.6 40.75,20.55 40.75,20.45 39.7,19.4 39.7,18.85 39.65,18.8 39.65,18.7 38.9,17.95 38.9,17.8 38.85,17.75 38.85,17.7 38.8,17.65 38.8,17.6 38.65,17.45 38.6,17.45 38.55,17.4 38.5,17.4 38.45,17.35 29.3,17.35 v28.9,17.75 | v41.6,56.12 41.6,56.15 | 41.85,52.9 41.6,53.15 41.7,53.25 41.7,55.65 41.65,55.7 41.65,55.75 41.6,55.8 41.6,56 v41.6,56.12 | 41.85,47.25 41.6,47 41.6,46.95 41.5,46.85 41.5,46.8 41.45,46.75 41.45,37.25 46,32.7 46,32.5 48.25,30.25 48.25,30.15 48.35,30.05 48.35,30 48.4,29.95 48.45,29.95 48.5,29.9 48.58,29.9 48.6,29.9 | 48.6,29.9 48.75,29.75 | 48.75,29.75 v48.77,29.75 | 48.75,29.75 v48.77,29.75 | 41.6,56.15 v41.6,56.12 | 48.6,29.9 v48.77,29.75 | 41.6,56.15 v41.6,56.12
EN  (via drill 0.2 pad 0.45, 0.2 pad 0.5)
  Top 0.15: R1.2 23.35,21.85 23.4,21.8 23.4,20.5 23.6,20.3 23.6,19.05 C3.1 v24.55,19.5 | 30.65,21.1 TP1.1 31.2,20.9 30.5,20.9 v30.5,20.95 | 30.65,21.1 v30.5,20.95 | 30.65,21.1 v30.5,20.95
  Route15 0.15: 24.6,19.55 27.5,19.55 27.6,19.65 27.8,19.65 28.05,19.9 28.15,19.9 28.6,20.35 29.9,20.35 v30.5,20.95 30.5,20.9 29.65,21.75 28.15,21.75 28.1,21.8 28,21.8 27.8,22 27.8,22.05 v27.6,22.25 | 24.6,19.55 v24.55,19.5 24.6,19.55
  Bottom 0.15: U1.7 41.25,52.3 41.05,52.1 41.05,50.65 40.2,49.8 40.2,49.5 40.15,49.45 40.15,42.5 38.65,41 38.65,40.95 37.45,39.75 37.45,39.7 37.35,39.6 37.35,39.5 37.3,39.45 37.3,35.85 26.2,24.75 26.2,24.65 26.15,24.6 26.15,24 26.2,23.95 26.2,23.85 27.6,22.45 | 27.6,22.45 v27.6,22.25 27.6,22.45
  other vias: 41.25,55.45
ESP_RF_CHIP  (via drill 0.2 pad 0.5)
  Top 0.15: U1.1 44.25,56 | 44.25,56 v44.35,56.12 | v44.35,56.12 44.35,56.15 | 44.35,56.15 44.2,56.3 | 44.2,56.3 44.2,56.35 L6.1 | v44.35,56.12 44.35,56.15 | 44.35,56.15 44.5,56 | 44.5,56 44.7,56 44.75,55.95 46.65,55.95 46.8,55.8 46.8,55.75 46.85,55.7 46.85,55 46.35,54.5 46.35,54.45 C42.1 | 44.25,56 v44.35,56.12 | 44.35,56.15 v44.35,56.12 | 44.2,56.3 v44.35,56.12 | 44.5,56 v44.35,56.12
ESP_VDD_RF  (via drill 0.2 pad 0.45, 0.2 pad 0.5)
  Top 0.15: 43.2,55.5 v43.25,55.69 | 43.2,55.65 v43.25,55.69 | v43.25,55.7 v43.25,55.69 | 43.42,55.6 v43.25,55.69 | 43.4,55.62 v43.25,55.69 | 43.33,55.62 v43.25,55.69
  Top 0.211: 38.7,55.2 38.1,54.6 38.1,53.85
  Top 0.265: 38.25,53.7 38.3,53.7 C34.1
  Top 0.274: 38.1,53.85 38.25,53.7
  Top 0.29: 38.7,55.2 L4.2 v38.7,55.85 | 43.2,55.5 43.2,55.65 v43.25,55.7 | v43.25,55.7 v43.25,55.69 v43.25,55.7 | U1.2 43.6,55.6 43.42,55.6 43.4,55.62 43.33,55.62 v43.25,55.7
  Route15 0.15: 42.55,56.5 42.45,56.6 40.5,56.6 | 43.2,55.5 v43.25,55.69 | 43.2,55.65 v43.25,55.69 | 43.15,55.7 v43.25,55.69 | 43.15,55.75 v43.25,55.69 | 38.7,56.05 v38.7,55.85
  Route15 0.159: 42.65,56.45 42.6,56.5 42.55,56.5
  Route15 0.16: 42.75,56.2 42.7,56.25 42.7,56.35
  Route15 0.176: 40.5,56.6 40.45,56.55
  Route15 0.185: 39.25,56.5 39.15,56.5 38.7,56.05
  Route15 0.198: 42.7,56.35 42.65,56.4 42.65,56.45
  Route15 0.211: 39.3,56.55 39.25,56.5
  Route15 0.217: 40.45,56.55 39.3,56.55
  Route15 0.228: 43.15,55.75 42.75,56.15 42.75,56.2
  Route15 0.29: 43.2,55.5 43.2,55.65 43.15,55.7 43.15,55.75 | 38.7,56.05 v38.7,55.85
ESP_VDD_SPI  (via drill 0.2 pad 0.5)
  Top 0.15: U1.18 41.25,50 | 41.25,50 v41.35,49.88 | v41.35,49.88 41.35,49.85 | 41.35,49.85 41.35,48.9 C37.1 | 41.25,50 v41.35,49.88 | 41.35,49.85 v41.35,49.88
ESP_XTAL_DRIVE
  Top 0.15: Y2.1 49.74,52.91 48.47,51.64 48.47,50.38 49.11,49.74 C40.1 48.6,50.2 48.55,50.2 48.5,50.25 48.45,50.25 48.4,50.3 L5.2
ESP_XTAL_N  (via drill 0.2 pad 0.5)
  Top 0.15: U1.29 45.5,53.25 | 45.5,53.25 v45.62,53.4 45.5,53.25 | v47.2,54.1 48.45,55.35 48.5,55.35 Y2.3 49,54.95 49.15,54.95 49.55,54.55 49.6,54.55 49.65,54.5 51.05,54.5 51.65,53.9 52,53.9 52.05,53.85 C41.1
  Route15 0.15: 45.65,53.4 v45.62,53.4 45.65,53.4 | 45.65,53.4 46.3,54.05 46.95,54.05 47,54.1 | 47,54.1 v47.2,54.1 47,54.1
ESP_XTAL_P  (via drill 0.2 pad 0.45, 0.2 pad 0.5)
  Top 0.15: v45.25,50.65 45.3,50.6 | 45.3,50.6 45.35,50.6 | 45.35,50.6 45.65,50.3 L5.1 | 45.3,50.6 v45.25,50.65 | 45.35,50.6 v45.25,50.65
  Bottom 0.15: U1.30 44.95,53 44.5,52.55 44.5,52.5 44.45,52.45 44.45,51.75 45.1,51.1 45.1,51 45.2,50.9 45.2,50.85 | 45.2,50.85 45.25,50.8 | 45.25,50.8 v45.25,50.65 | 45.2,50.85 v45.25,50.65 | 45.25,50.8 v45.25,50.65
  other vias: 44.95,53.75
FB_3V3  (via drill 0.3 pad 0.7)
  Top 0.15: R12.1 R11.2 52.4,34.55 v52.4,35 | U5.4 v44.25,37.4
  Bottom 0.15: v52.4,35 51.45,35 48.85,37.6 47.35,37.6 47.3,37.55 47.2,37.55 47.05,37.4 U5.4 v44.25,37.4
GND  (via drill 0.2 pad 0.45, 0.2 pad 0.5)
  Top 0.15: U2.1 32.85,25.25 | 32.85,25.25 v32.7,25.25 32.85,25.25 | U2.2 32.85,24.75 | 32.85,24.75 v32.7,24.75 32.85,24.75 | U2.3 32.85,24.25 | 32.85,24.25 v32.7,24.25 32.85,24.25 | 32.85,23.75 U2.4 33.73,23.75 33.77,23.7 33.85,23.7 34.02,23.52 34.02,23.5 34.05,23.48 34.05,23.45 34.08,23.43 34.08,21.57 34.05,21.55 34.05,21.5 34.02,21.48 34.02,21.45 34,21.43 33.98,21.43 33.92,21.38 33.88,21.38 33.85,21.35 33.5,21.35 U2.9 | 32.85,23.75 v32.7,23.75 32.85,23.75 | U2.20 38.75,19.35 | 38.75,19.35 v38.9,19.2 38.75,19.35 | U2.39 34.75,26.65 | 34.75,26.65 v34.75,26.8 34.75,26.65 | U2.41 36.89,23.39 v39.26,25.76 | U4.6 46.45,28.55 | 46.45,28.55 v46.6,28.43 46.45,28.55 | U4.8 47.45,28.55 | 47.45,28.55 v47.45,28.43 47.45,28.55 | U5.2 44.45,38.4 | 44.45,38.4 v44.33,38.4 44.45,38.4 | U3.4 29.2,26.17 v29.07,25.82 | U3.6 32.2,26.67 | 32.2,26.67 v32.33,26.67 32.2,26.67 | U6.3 22.22,48.83 | 22.22,48.83 v22.09,48.83 22.22,48.83 | U6.11 26.52,49.33 | 26.52,49.33 v26.64,49.33 26.52,49.33 | U6.15 24.12,51.23 | 24.12,51.23 v23.97,51.36 24.12,51.23 | U6.17 24.76,49.47 v25.64,50.35 | U7.2 50.35,42.93 v50.35,42.66 | C36.2 45.35,49.33 C39.2 | Y1.4 42.88,24.18 42.95,24.18 43.17,23.95 43.3,23.95 44.1,23.15 Y1.2 | C8.2 45.7,35.35 45.7,36.77 | 45.7,36.77 v45.75,36.83 45.7,36.77 | v47.5,35.88 47.5,35.25 C9.2 | R5.2 38.33,59.98 38.35,59.98 38.38,60 38.4,60 38.42,60.02 38.48,60.02 38.5,60.05 39.23,60.05 39.3,59.98 39.33,59.98 39.77,59.52 39.83,59.52 C44.2 | C19.2 25.55,23.4 26.05,22.9 26.07,22.9 26.12,22.85 26.2,22.85 26.23,22.82 26.93,22.82 27,22.9 27.02,22.9 27.5,23.38 | 27.5,23.38 27.52,23.38 C18.2 27.5,23.38 | J1.S3 40.25,66.3 40.38,66.42 41.27,66.42 ANT1.4 41.3,66.33 40.55,65.58 40.55,65.5 40.52,65.47 40.52,64.8 40.55,64.78 40.55,64.72 40.58,64.7 40.58,64.67 40.9,64.35 C45.2
  Top 0.15: C40.2 49.08,50.73 49.08,50.7 49.55,50.23 49.55,49.42 49.62,49.35 C31.2 | C5.2 44.65,26.57 44.42,26.35 v44.4,26.32 | 46.92,26.43 v46.85,26.35 46.92,26.43 | 46.92,26.43 46.92,26.68 C6.2 | C34.2 38,53.42 37.8,53.62 37.8,53.65 37.77,53.67 37.77,53.73 37.75,53.75 37.75,54.7 | v37.85,50.05 38.35,50.05 | 38.35,50.05 R19.2 38.35,50.05 | R23.2 46.65,63.67 46.62,63.67 46.55,63.6 46.52,63.6 46.45,63.52 45.73,63.52 45.7,63.55 45.65,63.55 45.6,63.6 45.58,63.6 45.55,63.62 45.55,63.65 45.52,63.67 45.52,63.73 45.5,63.75 45.5,63.95 ANT1.2 44.3,63.73 44.45,63.58 44.45,63.45 44.48,63.42 44.48,62.1 44.58,62 LED1.3 | 37.75,54.7 37.7,54.75 | 37.7,54.75 v37.65,54.8 | 37.75,54.7 37.7,54.75 | 37.7,54.75 v37.65,54.8 | 37.75,54.7 v37.65,54.8
  Route2 0.15: 45.85,36.73 v45.75,36.83 45.85,36.73 | 45.85,36.73 46.45,36.73 46.48,36.7 46.52,36.7 46.55,36.67 46.6,36.67 46.65,36.62 46.67,36.62 47.42,35.88 | 47.42,35.88 v47.5,35.88 47.42,35.88 | 44.42,26.35 v44.4,26.32 44.42,26.35 | 44.42,26.35 v46.85,26.35
  Bottom 0.15: J1.B12 31.62,61.38 J1.A1 v31.85,61.12 | J1.B1 37.12,61.85 37.23,61.75 37.23,61.73 37.25,61.7 37.25,61.67 37.27,61.65 37.27,61.23 J1.A12 | 37.7,54.75 v37.65,54.8 37.7,54.75 | 37.7,54.75 37.7,50.9 37.85,50.75 v37.85,50.05
  other vias: 42.5,53 36.5,23 30.7,26.92 46.7,30.5 24.37,49.08 38.45,50.15 40.72,49.32 42,49.25 46.3,55.4 46.48,53.22 51.75,30.5 53.85,30.5 22.15,25.7 24.25,25.7 24.85,18.8 25.45,23.4 26,21.1 27.35,17.1 27.5,44.5 27.55,23.4 29.05,18.8 29.65,23.4 30.95,44.5 31.75,18.8 34.15,44 36.46,45.69 39.72,41.38 44.15,17.1 44.2,23.15 45,37.9 45,38.4 45.3,29.75 46.45,29.1 46.45,37.9 48.55,53.2 49.55,31 50.25,55.4
  cutout Top: 40.8,63.35 48.8,63.35 48.8,65.9 48.16,66.18 47.51,66.45 46.86,66.71 46.2,66.95 45.54,67.18 44.88,67.4 44.21,67.61 43.53,67.8 42.85,67.97 42.17,68.14 41.49,68.28 40.8,68.42
  cutout Route2: 40.8,63.35 48.8,63.35 48.8,65.9 48.16,66.18 47.51,66.45 46.86,66.71 46.2,66.95 45.54,67.18 44.88,67.4 44.21,67.61 43.53,67.8 42.85,67.97 42.17,68.14 41.49,68.28 40.8,68.42
  cutout Route15: 40.8,63.35 48.8,63.35 48.8,65.9 48.16,66.18 47.51,66.45 46.86,66.71 46.2,66.95 45.54,67.18 44.88,67.4 44.21,67.61 43.53,67.8 42.85,67.97 42.17,68.14 41.49,68.28 40.8,68.42
  cutout Bottom: 40.8,63.35 48.8,63.35 48.8,65.9 48.16,66.18 47.51,66.45 46.86,66.71 46.2,66.95 45.54,67.18 44.88,67.4 44.21,67.61 43.53,67.8 42.85,67.97 42.17,68.14 41.49,68.28 40.8,68.42
  pour Top (isolate 0.127, rank 6): 68.6,34.5 68.47,37.47 68.08,40.42 67.44,43.33 66.54,46.16 65.41,48.91 64.03,51.55 62.43,54.06 60.62,56.42 58.61,58.61 56.42,60.62 54.06,62.43 51.55,64.03 48.91,65.41 46.16,66.54 43.33,67.44 40.42,68.08 37.47,68.47 34.5,68.6 31.53,68.47 28.58,68.08 25.67,67.44 22.84,66.54 20.09,65.41 17.45,64.03 14.94,62.43 12.58,60.62 10.39,58.61 8.38,56.42 6.57,54.06 4.97,51.55 3.59,48.91 2.46,46.16 1.56,43.33 0.92,40.42 0.53,37.47 0.4,34.5 0.53,31.53 0.92,28.58 1.56,25.67 2.46,22.84 3.59,20.09 4.97,17.45 6.57,14.94 8.38,12.58 10.39,10.39 12.58,8.38 14.94,6.57 17.45,4.97 20.09,3.59 22.84,2.46 25.67,1.56 28.58,0.92 31.53,0.53 34.5,0.4 37.47,0.53 40.42,0.92 43.33,1.56 46.16,2.46 48.91,3.59 51.55,4.97 54.06,6.57 56.42,8.38 58.61,10.39 60.62,12.58 62.43,14.94 64.03,17.45 65.41,20.09 66.54,22.84 67.44,25.67 68.08,28.58 68.47,31.53
  pour Route2 (isolate 0.127, rank 6): 68.6,34.5 68.47,37.47 68.08,40.42 67.44,43.33 66.54,46.16 65.41,48.91 64.03,51.55 62.43,54.06 60.62,56.42 58.61,58.61 56.42,60.62 54.06,62.43 51.55,64.03 48.91,65.41 46.16,66.54 43.33,67.44 40.42,68.08 37.47,68.47 34.5,68.6 31.53,68.47 28.58,68.08 25.67,67.44 22.84,66.54 20.09,65.41 17.45,64.03 14.94,62.43 12.58,60.62 10.39,58.61 8.38,56.42 6.57,54.06 4.97,51.55 3.59,48.91 2.46,46.16 1.56,43.33 0.92,40.42 0.53,37.47 0.4,34.5 0.53,31.53 0.92,28.58 1.56,25.67 2.46,22.84 3.59,20.09 4.97,17.45 6.57,14.94 8.38,12.58 10.39,10.39 12.58,8.38 14.94,6.57 17.45,4.97 20.09,3.59 22.84,2.46 25.67,1.56 28.58,0.92 31.53,0.53 34.5,0.4 37.47,0.53 40.42,0.92 43.33,1.56 46.16,2.46 48.91,3.59 51.55,4.97 54.06,6.57 56.42,8.38 58.61,10.39 60.62,12.58 62.43,14.94 64.03,17.45 65.41,20.09 66.54,22.84 67.44,25.67 68.08,28.58 68.47,31.53
  pour Bottom (isolate 0.127, rank 6): 68.6,34.5 68.47,37.47 68.08,40.42 67.44,43.33 66.54,46.16 65.41,48.91 64.03,51.55 62.43,54.06 60.62,56.42 58.61,58.61 56.42,60.62 54.06,62.43 51.55,64.03 48.91,65.41 46.16,66.54 43.33,67.44 40.42,68.08 37.47,68.47 34.5,68.6 31.53,68.47 28.58,68.08 25.67,67.44 22.84,66.54 20.09,65.41 17.45,64.03 14.94,62.43 12.58,60.62 10.39,58.61 8.38,56.42 6.57,54.06 4.97,51.55 3.59,48.91 2.46,46.16 1.56,43.33 0.92,40.42 0.53,37.47 0.4,34.5 0.53,31.53 0.92,28.58 1.56,25.67 2.46,22.84 3.59,20.09 4.97,17.45 6.57,14.94 8.38,12.58 10.39,10.39 12.58,8.38 14.94,6.57 17.45,4.97 20.09,3.59 22.84,2.46 25.67,1.56 28.58,0.92 31.53,0.53 34.5,0.4 37.47,0.53 40.42,0.92 43.33,1.56 46.16,2.46 48.91,3.59 51.55,4.97 54.06,6.57 56.42,8.38 58.61,10.39 60.62,12.58 62.43,14.94 64.03,17.45 65.41,20.09 66.54,22.84 67.44,25.67 68.08,28.58 68.47,31.53
I2C_SCL  (via drill 0.2 pad 0.45, 0.2 pad 0.5)
  Top 0.15: U2.7 32.85,22.25 | 32.85,22.25 v32.7,22.25 32.85,22.25 | U3.7 32.2,27.17 | 32.2,27.17 v32.33,27.32 | R14.2 37.6,41.4 | 38.4,40.6 v39.5,40.6 38.4,40.6 | v37.75,45.7 37.75,44.45 37.7,44.4 37.7,44.3 37.65,44.25 37.65,43.65 38.4,42.9 39.15,42.9 40.25,41.8 40.25,40.95 40.2,40.9 40.2,40.85 40.15,40.85 40.1,40.8 38.2,40.8 | 37.6,41.4 R14.2 | 32.2,27.17 32.2,27.18 | 32.2,27.18 32.27,27.25 | 32.27,27.25 32.27,27.27 | 32.27,27.27 v32.33,27.32 | v32.33,27.32 | 32.2,27.17 v32.33,27.32 | 32.2,27.18 v32.33,27.32 | 32.27,27.25 v32.33,27.32 | 32.27,27.27 v32.33,27.32 | v32.33,27.32 | 37.6,41.4 R14.2 | R14.2 38.2,40.8 | 38.2,40.8 38.4,40.6 | 38.2,40.8 R14.2 | R14.2 37.6,41.4
  Route2 0.15: U1.10 40.05,53.92 40.42,53.55 40.42,53.52 40.48,53.48 40.48,53.45 40.5,53.42 40.5,53.38 40.52,53.35 40.52,53.2 40.65,53.08 40.65,53.05 40.7,53 40.7,52.98 40.73,52.95 40.73,52.92 40.75,52.9 40.75,52.58 40.73,52.55 40.73,52.52 40.7,52.5 40.7,52.48 40.65,52.42 40.65,52.4 40.6,52.35 40.58,52.35 40.52,52.3 40.5,52.3 40.48,52.27 40.4,52.27 40.38,52.25 40.33,52.25 40.17,52.1 40.15,52.1 40.1,52.05 40.05,52.05 40.02,52.02 40.02,51.58 39.9,51.45 39.9,51 39.88,50.98 39.88,50.95 39.83,50.9 39.83,50.85 39.8,50.83 39.8,50.77 39.77,50.75 39.77,48.62 38.67,47.52 38.67,47.5 38.62,47.45 38.62,47.4 38.6,47.38 38.6,47.33 38.58,47.3 38.58,46.52 v37.75,45.7
  Route15 0.15: 32.2,27.18 32.2,27.17 v32.33,27.32 | 32.2,27.18 32.23,27.15 | 32.23,27.15 32.35,27.15 | 32.35,27.15 32.38,27.12 | 32.38,27.12 32.48,27.12 | 32.48,27.12 32.5,27.1 32.52,27.1 32.55,27.07 32.58,27.07 32.62,27.02 32.65,27.02 32.7,26.98 32.7,26.95 32.75,26.9 32.75,26.88 32.77,26.85 32.77,26.77 32.8,26.75 32.8,25.82 33.08,25.55 33.08,25.52 33.12,25.48 33.12,25.45 33.15,25.43 33.15,25.35 33.17,25.32 33.17,23.62 33.77,23.02 33.77,23 33.8,22.98 33.8,22.95 33.83,22.93 33.83,22.85 33.85,22.82 33.85,22.65 33.83,22.62 33.83,22.55 33.8,22.52 33.8,22.5 33.77,22.48 33.77,22.45 33.67,22.35 33.65,22.35 33.62,22.32 33.6,22.32 33.58,22.3 33.5,22.3 33.48,22.27 32.73,22.27 | 32.73,22.27 v32.7,22.25 32.73,22.27 | v39.5,40.6 39.2,40.3 39.2,40 38.95,39.75 38.95,34 36.3,31.35 36.3,31.3 v32.33,27.32 | v32.33,27.32 | 32.2,27.18 v32.33,27.32 | 32.23,27.15 v32.33,27.32 | 32.35,27.15 v32.33,27.32 | 32.38,27.12 v32.33,27.32 | 32.48,27.12 v32.33,27.32 | v32.33,27.32
  other vias: 40.05,54.25
I2C_SDA  (via drill 0.2 pad 0.5)
  Top 0.15: U1.9 39.5,54.75 | U2.5 32.85,23.25 v32.65,23.1 | U3.8 31.65,27.65 | v36.95,40.25 36.65,40.25 R13.2 | 35.5,41.4 R13.2 | R13.2 35.5,41.4 | 35.5,41.4 35.3,41.2 35.3,41.15 31.75,37.6 31.05,37.6 31,37.55 30.95,37.55 30.75,37.35 30.75,37.25 30.7,37.2 30.7,31.05 30.75,31 30.75,28.55 31.65,27.65 | 31.65,27.65 U3.8 | 39.5,54.75 39.4,54.75 | 39.4,54.75 v39.38,54.75 | 31.65,27.65 U3.8 | U3.8 31.65,27.8 v31.65,28.1 | R13.2 35.5,41.4 | 39.5,54.75 39.4,54.75 | 39.4,54.75 v39.38,54.75 | 39.5,54.75 v39.38,54.75
  Route2 0.15: 39.4,54.73 v39.38,54.75 39.4,54.73 | 39.4,54.73 40.15,54.73 40.17,54.7 40.23,54.7 40.25,54.67 40.27,54.67 40.33,54.62 40.35,54.62 40.42,54.55 40.42,54.52 40.48,54.48 40.48,54.45 40.5,54.42 40.5,54.38 40.52,54.35 40.52,53.92 40.7,53.75 40.7,53.73 40.75,53.67 40.75,53.65 40.77,53.62 40.77,53.6 40.8,53.58 40.8,53.52 40.83,53.5 40.83,53.45 40.85,53.42 40.85,53.35 40.92,53.27 40.92,53.25 40.98,53.2 40.98,53.17 41,53.15 41,53.12 41.02,53.1 41.02,53.08 41.05,53.05 41.05,53 41.08,52.98 41.08,50.38 40.3,49.6 40.3,49.58 40.27,49.55 40.27,49.52 40.25,49.5 40.25,49.45 40.23,49.42 40.23,43.52 v36.95,40.25
  Route15 0.15: v31.65,28.1 31.65,27.8 31.8,27.65 31.8,26.4 32.1,26.1 32.1,23.65 32.2,23.55 32.2,23.45 32.4,23.25 32.5,23.25 | 32.5,23.25 v32.65,23.1 32.5,23.25
  Bottom 0.15: 39.4,54.75 v39.38,54.75 39.4,54.75 | 39.4,54.75 39.2,54.55 39.2,54.45 39.15,54.4 39.15,54.3 38.95,54.1 38.95,54.05 38.85,53.95 38.85,51.8 38.6,51.55 | 38.6,44.65 38.85,44.4 38.85,44.3 38.95,44.2 38.95,42.55 38.85,42.45 38.85,42.35 38.8,42.3 38.8,42.25 36.95,40.4 | 36.95,40.4 v36.95,40.25 36.95,40.4
I2S_BCLK  (via drill 0.2 pad 0.45)
  Route15 0.15: 23.6,50.7 23.45,50.85 23.45,51.55 23.5,51.6 23.5,51.65 23.6,51.75 23.65,51.75 23.7,51.8 23.75,51.8 23.8,51.85 24.7,51.85 24.75,51.8 24.85,51.8 24.9,51.75 24.95,51.75 25.05,51.65 34.9,51.65 35.8,52.55 38.9,52.55 39.1,52.75 v40.29,52.75 | 23.6,50.7 U6.16 23.6,50.7 | v40.3,52.75 v40.29,52.75 | v40.3,52.75 v40.29,52.75 | v40.29,52.75 v40.3,52.75
  other vias: 23.62,50.68
I2S_DIN  (via drill 0.2 pad 0.45, 0.2 pad 0.5)
  Top 0.15: U6.1 22.22,49.83 | 22.22,49.83 v22.09,49.83 22.22,49.83 | v43.55,46.85 42.75,46.85 42.55,47.05 42.5,47.05 42.4,47.15 42.35,47.15 42.3,47.2 v39.1,47.2 | 36.95,47.2 v37.15,47.2 36.95,47.2 | 36.95,47.2 36.85,47.3 36.75,47.3 36.7,47.35 v30.3,47.35
  Route15 0.15: U1.27 44.75,52.05 44.75,51.4 44.7,51.35 44.7,47.2 v44.9,47 | v39.1,47.2 v37.15,47.2 | v30.3,47.35 27.8,47.35 26.85,48.3 26.8,48.3 26.7,48.4 26.6,48.4 26.55,48.45 23.5,48.45 22.1,49.85 | 22.1,49.85 v22.09,49.83 22.1,49.85
  Bottom 0.15: v44.9,47 43.7,47 | 43.7,47 v43.55,46.85 43.7,47
  other vias: 44.95,52.25
I2S_LRCLK  (via drill 0.2 pad 0.5)
  Top 0.15: U6.14 24.62,51.23 | 24.62,51.23 v24.62,51.36 24.62,51.23 | U1.16 39.8,51.25 39.7,51.15 39.65,51.15 39.6,51.1 39.5,51.1 39.45,51.05 38.2,51.05 38.1,50.95 37.3,50.95 | 37.3,50.95 v37.2,50.85 37.3,50.95
  Route15 0.15: v37.2,50.85 36.7,51.35 24.6,51.35 | 24.6,51.35 v24.62,51.36 24.6,51.35
ILIM
  Top 0.15: R8.1 49.74,30.05 50.38,29.42 51.64,29.42 52.28,30.05 52.28,31.32 51.64,31.96 48.47,31.96 47.84,31.32 U4.12
ISET  (via drill 0.3)
  Top 0.15: v45.3,31.96 45.93,31.96 U4.16 | v50.38,31.32 51.01,30.69 R9.1
  Route15 0.15: v50.38,31.32 49.74,31.96 45.93,31.96 v45.3,31.96
LED_CHAIN_1
  Top 0.15: LED1.2 49.11,59.9 49.74,60.53 50.38,59.9 LED2.4
LED_CHAIN_2
  Top 0.15: LED3.4 56.09,55.45 56.73,56.09 56.73,58.63 LED2.2
LED_CHAIN_3
  Top 0.15: LED4.4 60.53,49.74 61.8,51.01 61.8,52.91 LED3.2
LED_CHAIN_4
  Top 0.15: LED5.4 63.08,44.02 65.61,46.56 LED4.2
LED_CHAIN_5  (via drill 0.3)
  Top 0.15: v64.34,31.96 64.34,30.69 LED6.4 | v64.34,37.04 66.88,39.58 LED5.2
  Route15 0.15: v64.34,37.04 v64.34,31.96
LED_CHAIN_6
  Top 0.15: LED7.4 63.08,24.34 64.98,24.34 66.25,25.61 LED6.2
LED_CHAIN_7
  Top 0.15: LED8.4 59.9,17.99 63.08,17.99 LED7.2
LED_CHAIN_8
  Top 0.15: LED9.4 55.45,12.91 56.09,12.27 58.63,12.27 LED8.2
LED_CHAIN_9
  Top 0.15: LED9.2 53.55,7.83 52.91,8.46 52.91,9.73 51.64,11 51.01,11 49.74,9.73 49.74,9.1 LED10.4
LED_CHAIN_10
  Top 0.15: LED11.4 44.02,5.93 46.56,3.39 LED10.2
LED_CHAIN_11
  Top 0.15: LED12.4 37.04,4.66 39.58,2.12 LED11.2
LED_CHAIN_12
  Top 0.15: LED13.4 30.05,4.66 30.05,4.02 32.59,1.48 LED12.2
LED_CHAIN_13
  Top 0.15: LED14.4 23.7,6.56 23.7,4.02 24.98,2.75 LED13.2
LED_CHAIN_14
  Top 0.15: LED15.4 17.99,9.1 17.36,8.46 17.36,5.93 LED14.2
LED_CHAIN_15
  Top 0.15: LED15.2 12.27,10.37 12.27,14.18 LED16.4
LED_CHAIN_16
  Top 0.15: LED16.2 7.2,16.09 7.2,19.26 7.83,19.89 LED17.4
LED_CHAIN_17
  Top 0.15: LED17.2 3.39,23.07 5.93,25.61 LED18.4
LED_CHAIN_18  (via drill 0.3)
  Top 0.15: v1.48,31.32 1.48,30.05 LED18.2 | v4.02,37.67 4.66,38.31 LED19.4
  Route15 0.15: v1.48,31.32 4.02,33.87 v4.02,37.67
LED_CHAIN_19
  Top 0.15: LED19.2 2.75,44.66 5.29,44.66 6.56,45.93 LED20.4
LED_CHAIN_20
  Top 0.15: LED20.2 5.93,51.64 9.73,51.64 LED21.4
LED_CHAIN_21
  Top 0.15: LED22.4 14.18,56.73 10.37,56.73 LED21.2
LED_CHAIN_22
  Top 0.15: LED23.4 21.8,57.36 21.8,59.9 19.26,62.44 16.09,62.44 LED22.2
LED_DATA_0  (via drill 0.3)
  Top 0.15: v35.77,55.45 35.77,53.55 37.67,51.64 R21.2 | v42.12,59.9 42.76,59.27 LED1.4
  Bottom 0.15: v35.77,55.45 40.22,59.9 v42.12,59.9
LED_DATA_3V3  (via drill 0.2 pad 0.45, 0.2 pad 0.5)
  Top 0.15: v39.45,56.05 39.25,56.25 39.25,56.65 39.2,56.7 39.2,56.85 R20.1 | 39.85,53.2 40,53.2 v39.81,53.25 | 39.85,53.2 v39.8,53.25 | v39.8,53.25 v39.81,53.25 | 39.85,53.2 v39.81,53.25 | v39.8,53.25 v39.81,53.25
  Route2 0.15: v36.88,53.12 38.05,53.12 38.08,53.1 39.65,53.1 v39.81,53.25 | v39.81,53.25 v39.8,53.25 | v39.8,53.25 39.5,53.25 39.48,53.23 39.25,53.23 39.23,53.25 39.17,53.25 39.15,53.27 39.1,53.27 39.05,53.33 39.02,53.33 38.95,53.4 38.95,53.42 38.9,53.48 38.9,53.52 38.88,53.55 38.88,53.6 38.85,53.62 38.85,54.92 38.27,55.5 38.27,55.52 38.23,55.58 38.23,55.62 38.2,55.65 38.2,55.7 38.17,55.73 38.17,55.95 38.2,55.98 38.2,56.02 38.23,56.05 38.23,56.1 38.27,56.15 38.27,56.17 38.35,56.25 38.38,56.25 38.42,56.3 38.48,56.3 38.5,56.33 38.55,56.33 38.58,56.35 39.15,56.35 39.25,56.25 v39.45,56.05 | v39.8,53.25 v39.81,53.25
  Route15 0.15: 40.5,55 40.5,54 40.45,53.95 40.45,53.9 40.05,53.5 v39.8,53.25 | 39.8,53.2 39.75,53.15 | 39.75,53.15 39.7,53.15 | 39.7,53.15 39.65,53.1 v39.81,53.25 | 36.6,46.8 v36.6,46.85 36.6,46.8 | 36.6,46.8 U8.2 | U8.2 | v39.8,53.25 v39.81,53.25 | v39.81,53.25 40,53.2 39.85,53.2 | 39.8,53.2 v39.81,53.25 | 39.75,53.15 v39.81,53.25 | 39.7,53.15 v39.81,53.25 | v39.8,53.25 v39.81,53.25 | 39.85,53.2 39.8,53.2 | 39.85,53.2 v39.81,53.25
  Bottom 0.15: v36.6,46.85 36.6,52.85 v36.88,53.12
  other vias: 35.51,45.69
LED_DATA_BUF
  Top 0.15: R21.1 36.41,51.64 36.41,48.47 U8.4
LED_EN  (via drill 0.2 pad 0.5)
  Top 0.15: U1.8 40.75,56 | 40.75,56 v40.75,56.12 40.75,56 | U7.3 51.3,42.93 v51,42.66 | 39.15,49.85 R19.1 39.15,49.85 | 39.15,49.85 v39.15,49.9 | 39.15,49.85 v39.15,49.9 | v39.15,50.5 v39.15,49.9 | v39.15,49.9 39.15,49.85
  Route15 0.15: v39.15,49.9 41.1,47.95 41.2,47.95 41.5,47.65 42.1,47.65 42.35,47.4 43.85,47.4 49.05,42.2 49.1,42.2 49.15,42.15 49.25,42.15 49.3,42.1 50.45,42.1 50.5,42.15 50.55,42.15 50.6,42.2 50.65,42.2 50.8,42.35 50.8,42.45 v51,42.65 | v51,42.65 v51,42.66 v51,42.65
  Bottom 0.15: v40.75,56.12 40.75,56.15 | 39.15,50.6 39.95,51.4 39.95,51.95 39.98,51.98 40,51.98 40.27,52.25 40.38,52.25 40.4,52.27 40.48,52.27 40.5,52.3 40.52,52.3 40.58,52.35 40.6,52.35 40.65,52.4 40.65,52.42 40.7,52.48 40.7,52.5 40.73,52.52 40.73,52.55 40.75,52.58 40.75,53.15 U1.8 40.75,56 v40.75,56.12 | 39.15,50.6 v39.15,50.5 39.15,50.6 | 40.75,56.15 v40.75,56.12 | 40.75,56.15 v40.75,56.12
NFC_ANT_N  (via drill 0.3, 0.3 pad 0.7)
  Top 0.15: v32.59,17.99 31.96,17.36 31.32,17.36 C26.2 | 38.95,17.36 v38.31,17.99 | 38.95,17.36 38.95,16.72 39.58,16.09 41.48,16.09 42.12,16.72 42.12,17.36 C25.2 | 38.95,17.36 C28.1 | v33.95,13.65 34.05,13.55 | 34.05,13.55 34.05,13.4 | 34.05,13.4 34.1,13.35 | 34.1,13.35 34.1,13.3 34.15,13.25 34.15,12.85 J3.3 | 34.05,13.55 v33.95,13.65 | 34.05,13.4 v33.95,13.65 | 34.1,13.35 v33.95,13.65
  Route15 0.15: v32.59,17.99 33.23,17.36 37.67,17.36 v38.31,17.99 | v32.59,17.99 v32.6,18 | v32.6,18 32.7,17.9 | 32.7,17.9 32.7,17.85 | 32.7,17.85 32.75,17.8 | 32.75,17.8 32.75,14.85 v33.95,13.65 | v32.6,18 v32.59,17.99 | 32.7,17.9 v32.59,17.99 | 32.7,17.85 v32.59,17.99 | 32.75,17.8 v32.59,17.99
NFC_ANT_P
  Top 0.15: 29.42,17.36 30.05,17.99 30.69,17.36 C26.1 | 29.42,17.36 29.42,16.72 30.05,16.09 31.96,16.09 32.59,16.72 32.59,17.36 C27.1 32.65,16.35 33.15,15.85 33.15,15.8 33.2,15.75 33.2,15.4 34.7,13.9 34.7,12.8 J3.2 | 29.42,17.36 C24.2
NFC_EMC1
  Top 0.15: L2.2 24.98,17.36 26.24,17.36 C22.1 26.8,17.55 26.8,17.6 26.85,17.6 26.9,17.65 27.9,17.65 C24.1
NFC_EMC2
  Top 0.15: C25.1 40.85,17.36 41.48,17.99 42.76,17.99 43.39,17.36 C23.1 43.55,16.7 43.55,16.65 43.6,16.6 43.6,16.55 43.65,16.55 43.7,16.5 45.65,16.5 45.7,16.55 45.75,16.55 46.2,17 46.2,17.05 L3.2
NFC_IRQ  (via drill 0.2 pad 0.45, 0.2 pad 0.5)
  Top 0.15: U2.8 32.85,21.75 v32.65,21.6 32.15,21.1 32.15,20.55 32.1,20.5 32.1,20.45 31.95,20.3 29.05,20.3 29,20.35 28.95,20.35 28.85,20.45 28.85,20.5 28.8,20.55 28.8,21.8 v28.3,22.3 | v45.2,48.65 45.2,47.4 45.35,47.25 45.35,47.15 45.4,47.1 45.4,46.5 v44.7,45.8
  Route2 0.15: v34.48,27.77 32.27,25.57 32.27,25.55 32.23,25.5 32.23,25.45 32.2,25.43 32.2,25.38 32.17,25.35 32.17,23.3 32.15,23.27 32.15,23.23 32.12,23.2 32.12,22.12 32.23,22.02 32.23,21.98 32.27,21.93 32.27,21.9 32.35,21.82 32.38,21.82 32.42,21.77 32.48,21.77 v32.65,21.6
  Route15 0.15: v44.7,45.8 v40.75,41.85
  Bottom 0.15: v45.2,48.65 43.25,50.6 43.25,53.35 43.2,53.4 43.2,53.45 42.75,53.9 v42.75,55.2 | v42.75,55.2 v42.75,55.21 v42.75,55.2 | v40.75,41.85 40.17,41.27 40.17,40.58 39.95,40.35 39.95,40.3 39.45,39.8 38.17,39.8 38.15,39.77 38.1,39.77 38.08,39.75 38.02,39.75 38,39.73 37.98,39.73 37.92,39.67 37.9,39.67 37.8,39.58 37.8,39.55 37.75,39.5 37.75,39.48 37.73,39.45 37.73,39.4 37.7,39.38 37.7,39.33 37.67,39.3 37.67,30.98 v34.48,27.77
NFC_RXC1
  Top 0.15: C27.2 33.87,17.36 34.5,17.36 R15.1
NFC_RXC2
  Top 0.15: R16.1 37.04,17.36 37.04,17.99 37.67,18.62 38.95,18.62 40.22,17.36 C28.2
NFC_RXN  (via drill 0.2 pad 0.45, 0.2 pad 0.5)
  Top 0.15: 40.75,21.7 v40.75,21.9 40.75,21.7 | 40.75,21.7 40.8,21.65 40.8,21.55 40.85,21.5 40.85,20.1 40.2,19.45 v40.2,19.2 | 38.3,16.65 v38.3,16.5 38.3,16.65 | 38.3,16.65 R16.2
  Bottom 0.15: U2.15 37,19.9 37.4,20.3 37.45,20.3 37.5,20.35 38.55,20.35 40.05,21.85 40.15,21.85 40.2,21.9 v40.75,21.9 | v40.2,19.2 40,19 40,18.65 39.95,18.6 39.95,18.5 39.2,17.75 39.2,17.6 39.15,17.55 39.15,17.5 39.1,17.45 39.1,17.4 38.35,16.65 | 38.35,16.65 38.35,16.55 | 38.35,16.55 v38.3,16.5 | 38.35,16.65 v38.3,16.5 | 38.35,16.55 v38.3,16.5
  other vias: 36.25,19.9
NFC_RXP  (via drill 0.2 pad 0.5)
  Top 0.15: U2.16 36.75,19.35 | 36.75,19.35 v36.75,19.2 | v36.75,19.2 36.1,18.55 36.1,17.45 R15.2 | 36.75,19.35 v36.75,19.2
NFC_TX1  (via drill 0.2 pad 0.5)
  Top 0.15: U2.21 40.15,20.75 | 40.15,20.75 v40.3,20.75 40.15,20.75 | v25,17.85 24.8,17.65 24.75,17.65 24.65,17.55 24.65,17.5 L2.1
  Route2 0.15: v40.3,20.75 40.1,20.55 33.83,20.55 32.9,19.62 32.88,19.62 32.83,19.57 32.8,19.57 32.77,19.55 32.75,19.55 32.7,19.5 32.62,19.5 32.6,19.48 32.5,19.48 32.48,19.45 30.93,19.45 30.9,19.43 30.38,19.43 29.35,18.4 29.32,18.4 29.27,18.35 29.25,18.35 29.23,18.32 29.18,18.32 29.15,18.3 28.52,18.3 28.5,18.27 25.43,18.27 v25,17.85
  Bottom 0.15: 32.8,18.55 32.85,18.5 32.9,18.5 33.15,18.25 36.15,18.25 36.2,18.3 37,18.3 37.05,18.35 37.8,18.35 38,18.55 38.45,18.55 38.55,18.65 39,18.65 39.05,18.7 39.15,18.7 39.35,18.9 39.35,19 39.4,19.05 39.4,19.85 40.1,20.55 v40.3,20.75 | 25.7,18.55 25.43,18.27 v25,17.85
NFC_TX2  (via drill 0.2 pad 0.5)
  Top 0.15: U2.19 38.25,19.35 | 38.25,19.35 v38.25,19.2 38.25,19.35 | 43.75,17.65 v43.65,17.75 43.75,17.65 | 43.75,17.65 44.7,17.65 L3.1
  Route15 0.15: v38.25,19.2 38.35,19.1 | 38.35,19.1 38.35,19.05 | 38.35,19.05 38.4,19 38.4,18.9 38.6,18.7 38.7,18.7 38.75,18.65 39.45,18.65 39.55,18.55 41.7,18.55 42.3,17.95 43.45,17.95 v43.65,17.75 | 38.35,19.1 v38.25,19.2 | 38.35,19.05 v38.25,19.2
NFC_VDD  (via drill 0.2 pad 0.5)
  Top 0.15: U2.26 40.15,23.25 | 40.15,23.25 v40.3,23.4 | 40.15,23.75 U2.27 40.15,23.75 | 38.75,26.65 U2.31 38.77,26.12 38.77,26.8 v38.75,26.8 | 38.75,26.65 v38.75,26.8 | v38.75,26.8 35.45,26.8 35,27.25 34.9,27.25 34.85,27.3 34.6,27.3 34.55,27.25 34.45,27.25 32.95,25.75 32.55,25.75 32.5,25.7 32.4,25.7 32.2,25.5 32.2,25.4 32.15,25.35 32.15,24.8 C16.1 30.25,22.9 | 30.25,22.9 v30.25,22.8 | v24.5,24.9 21.95,24.9 C15.1 | 40.27,23.75 40.3,23.73 | v30.25,22.8 30.25,22.9 | 40.15,23.25 v40.3,23.4 | 38.75,26.65 v38.75,26.8 | 30.25,22.9 v30.25,22.8 | 40.15,23.75 40.27,23.75 | 40.27,23.75 40.3,23.75 | v40.3,23.4 40.3,23.73 | 40.3,23.73 40.3,23.75 | 40.15,23.75 40.27,23.75 | 40.3,23.75 40.3,23.73 | 40.3,23.73 v40.3,23.4